# EasyEDA Pro project BMS-Mainboard.epro, schematic Schematic1

## Sheets
1 BQ7693: Assembly Variant: Basic; Board Name: Board1; Create Date: 2026-09-22; Page Name: P1; Project Name: BMS 主控板; Schematic Name: Schematic1; Update Date: 2026-09-22; Company: 嘉立创EDA; Page Size: A4; Version: V1.0
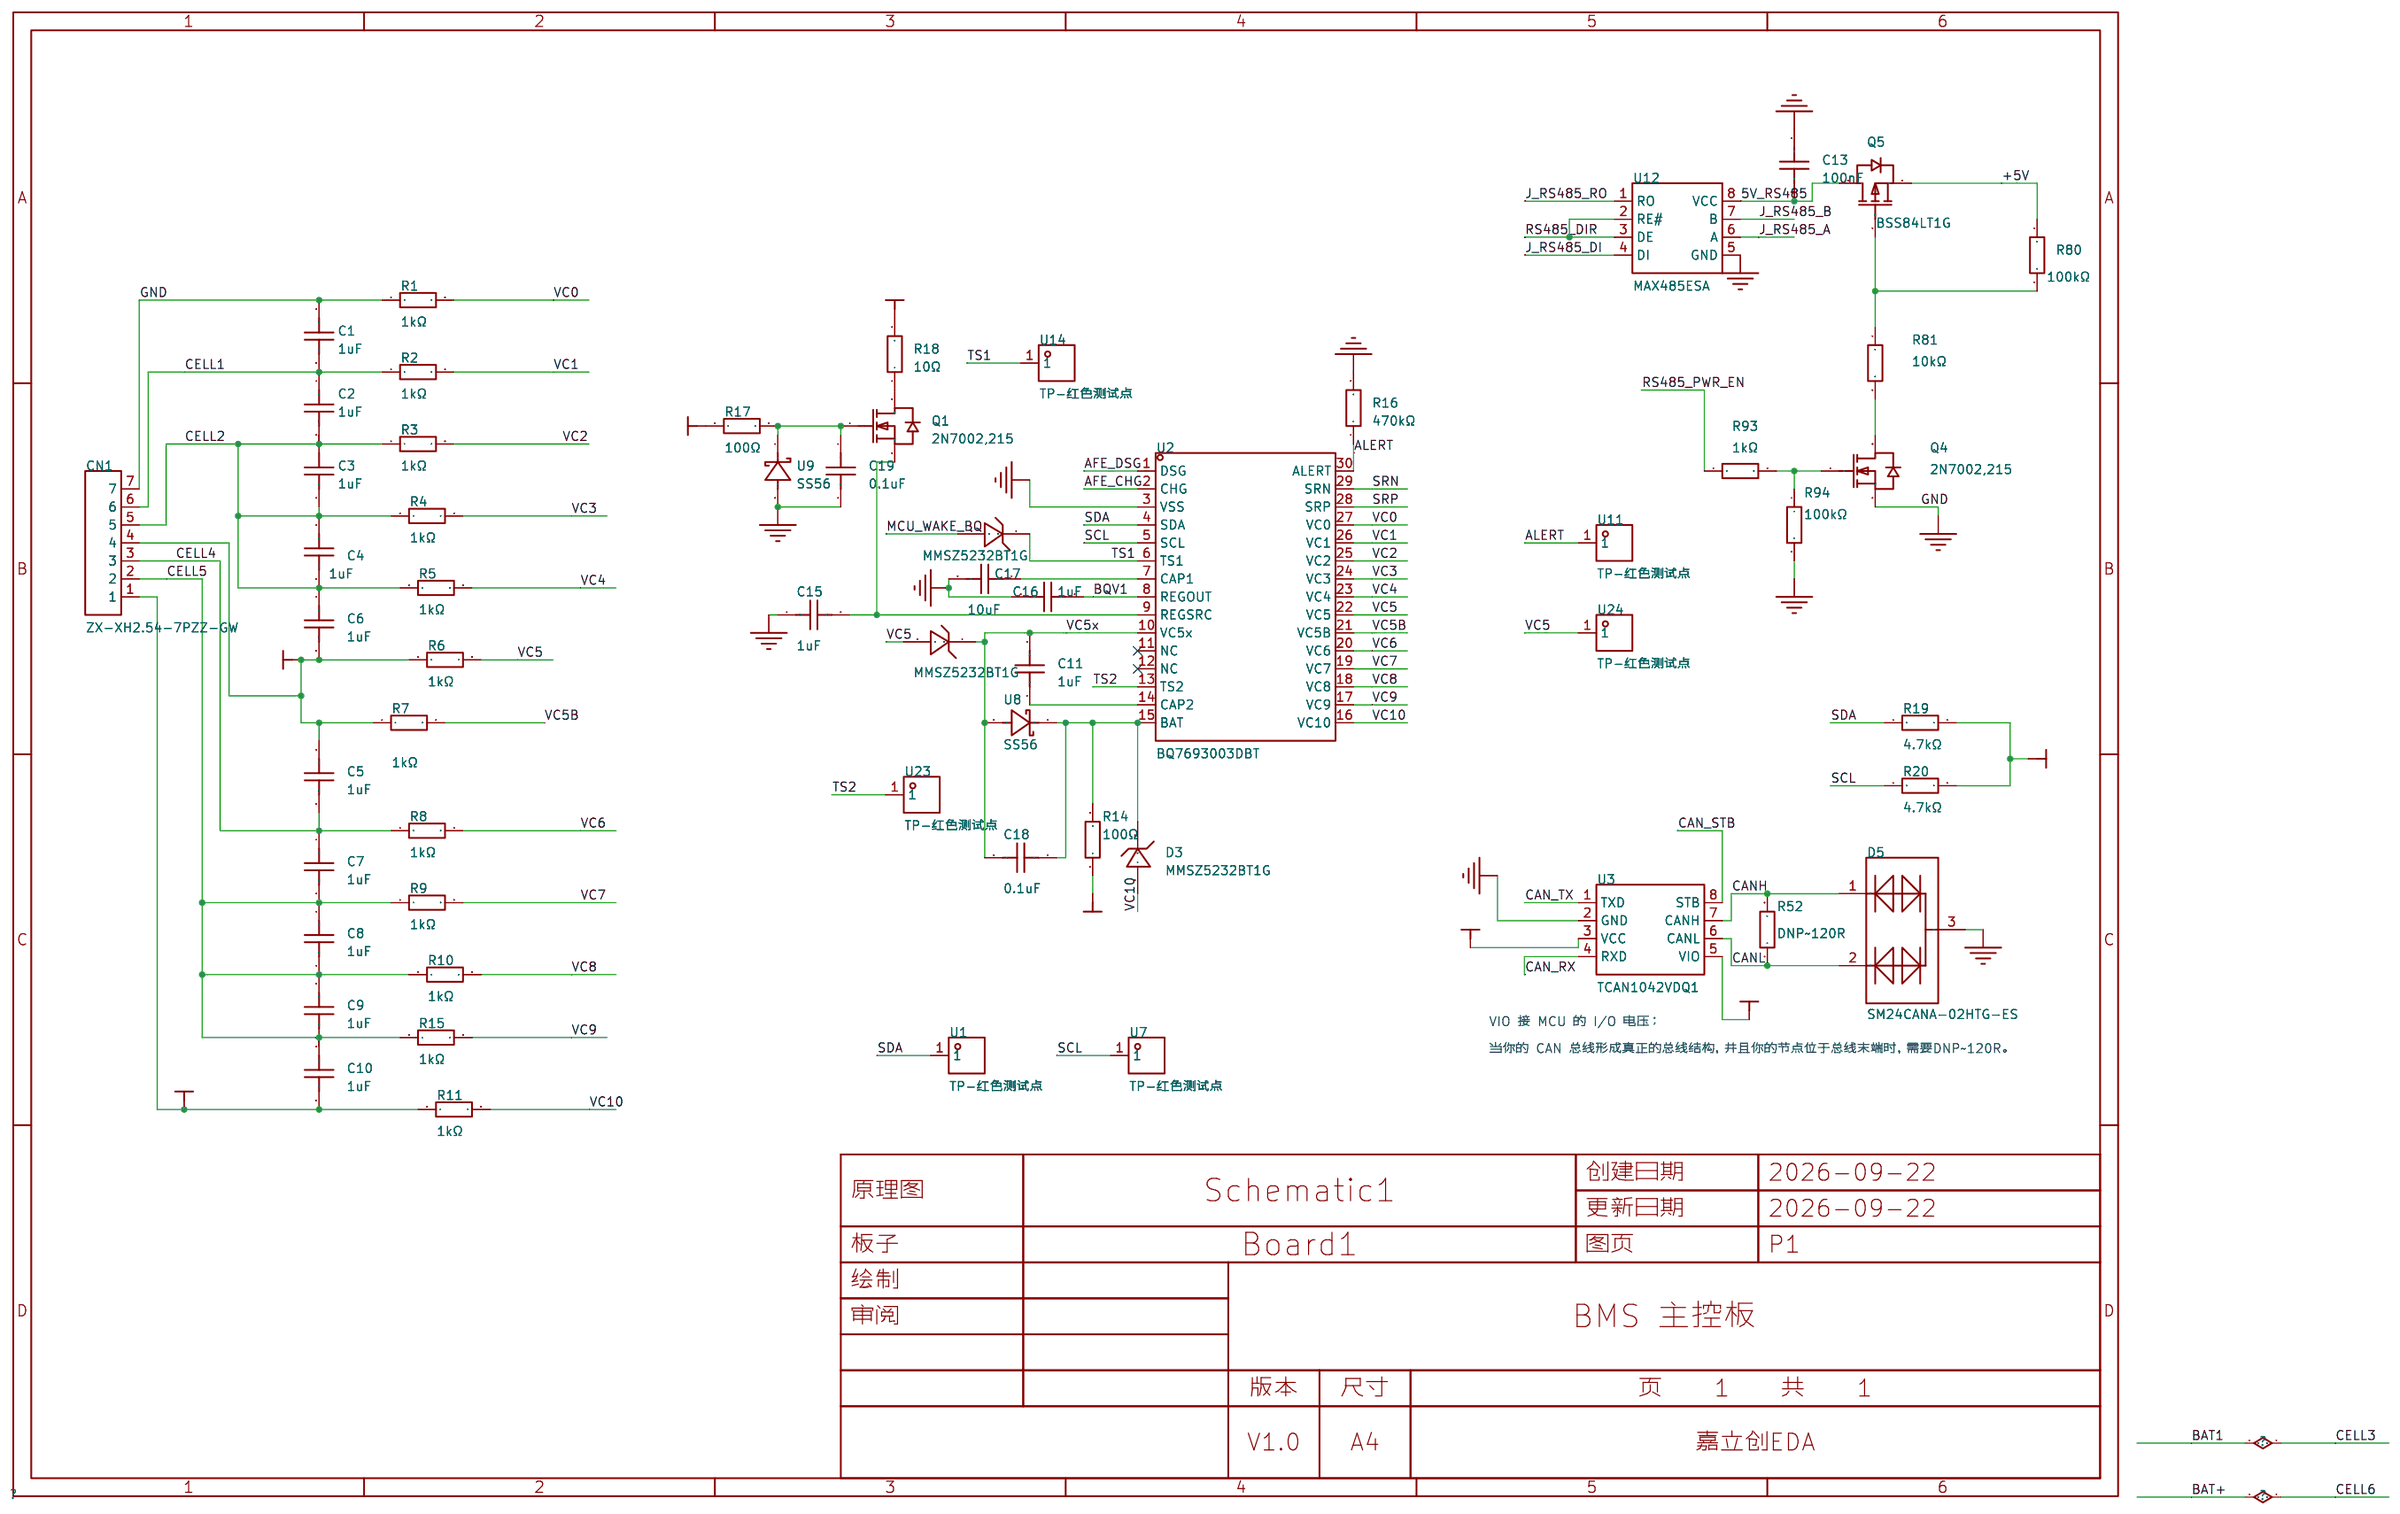
[diagram p1: BQ7693]
2 power: Create Date: 2026-09-27; Page Name: P2; Update Date: 2026-09-27
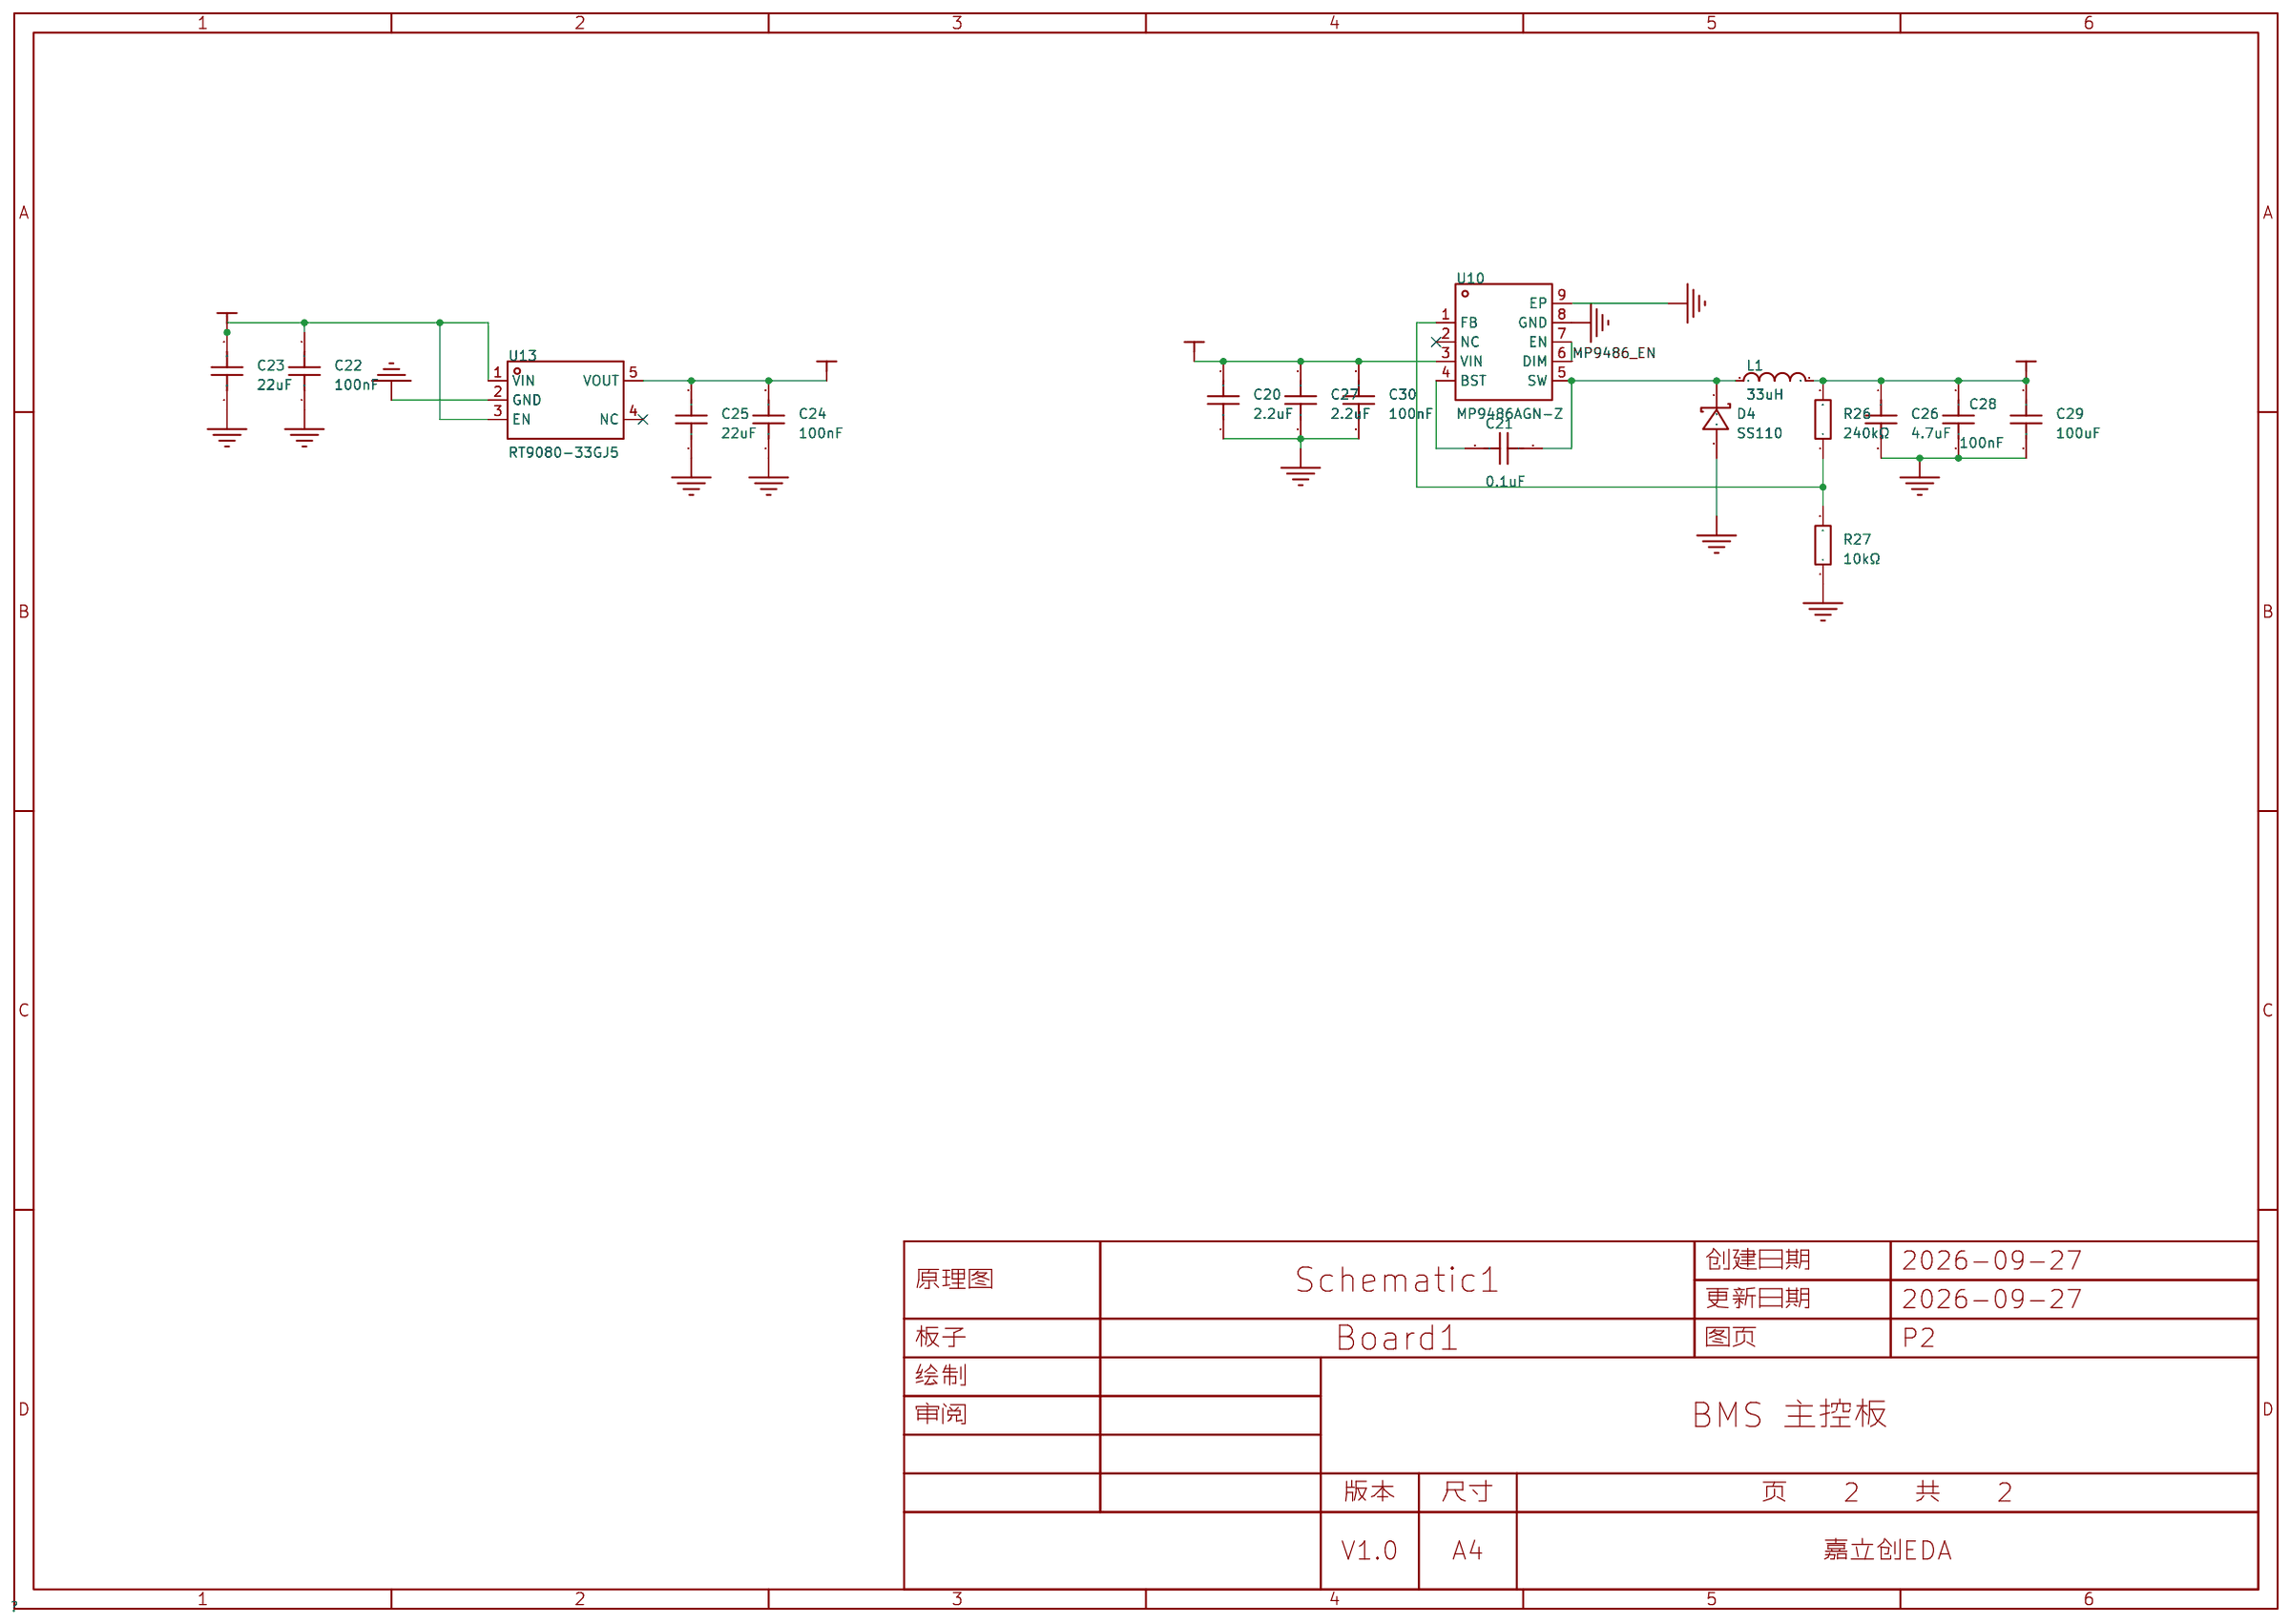
[diagram p2: power]
3 input_detect: Create Date: 2026-10-07; Page Name: P2; Update Date: 2026-10-07
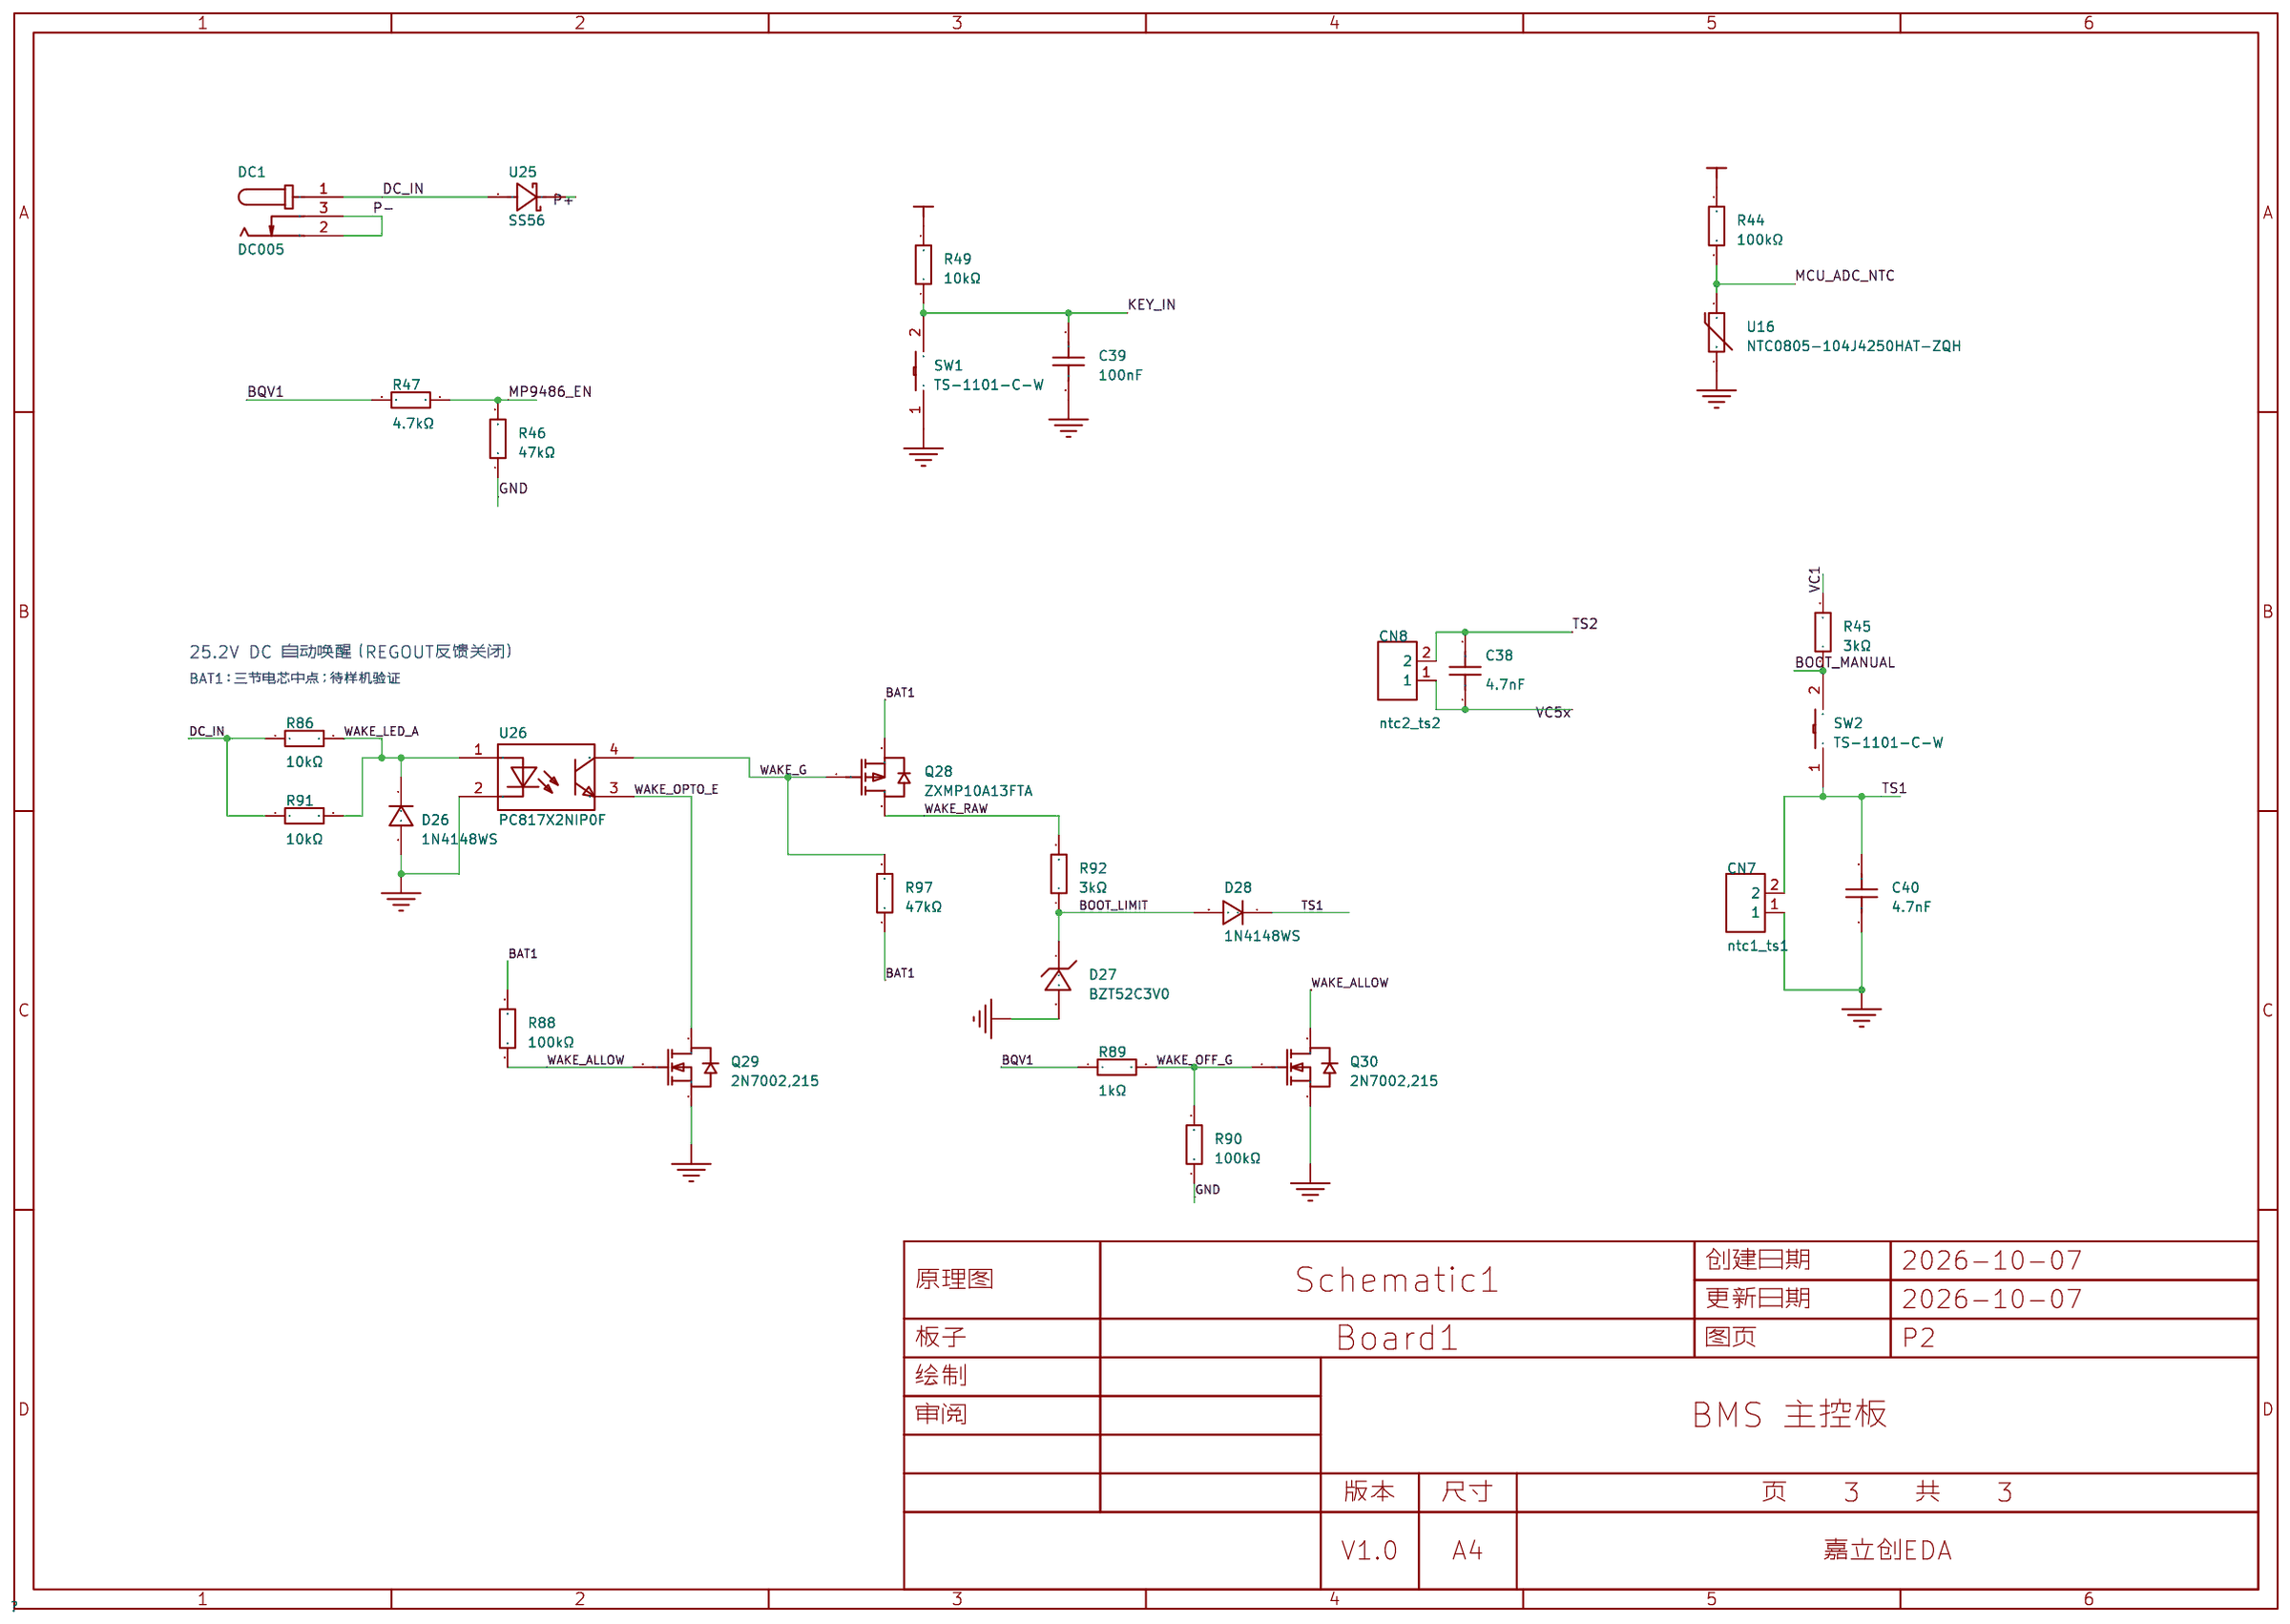
[diagram p3: input_detect]
4 output_detect: Create Date: 2026-10-07; Page Name: P2; Update Date: 2026-10-07
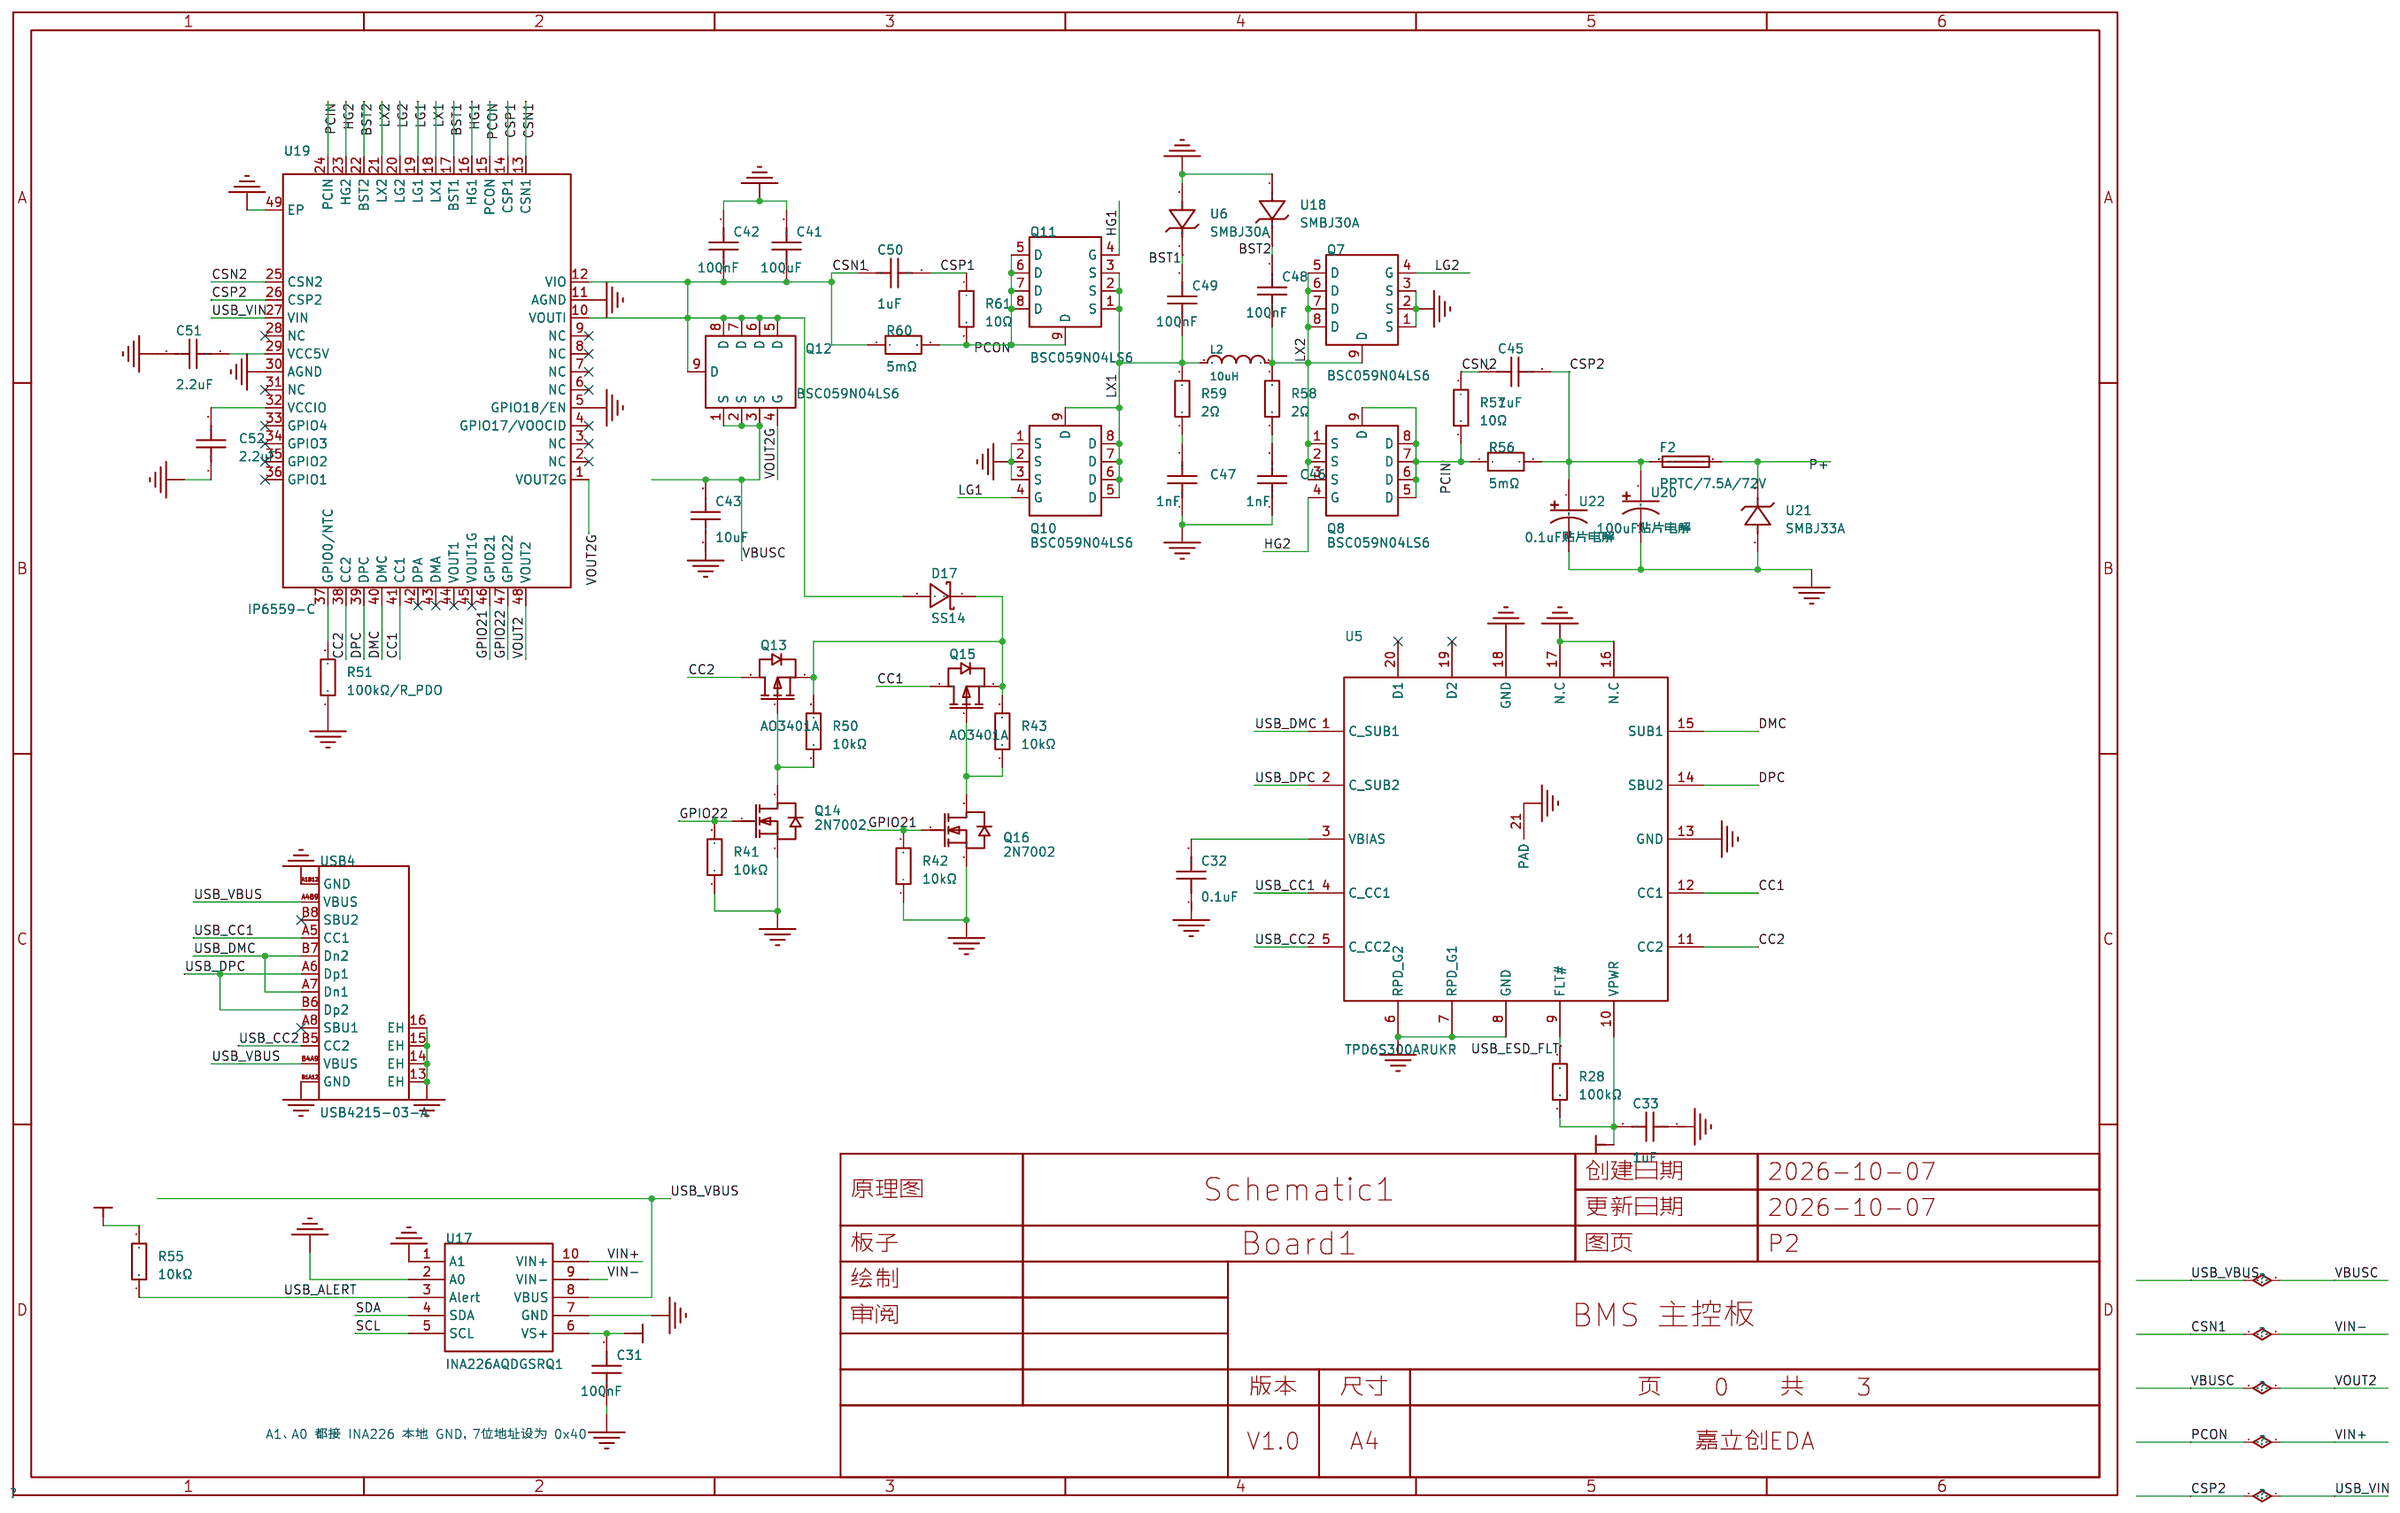
[diagram p4: output_detect]
5 esp32c3: Create Date: 2026-10-19; Update Date: 2026-10-19
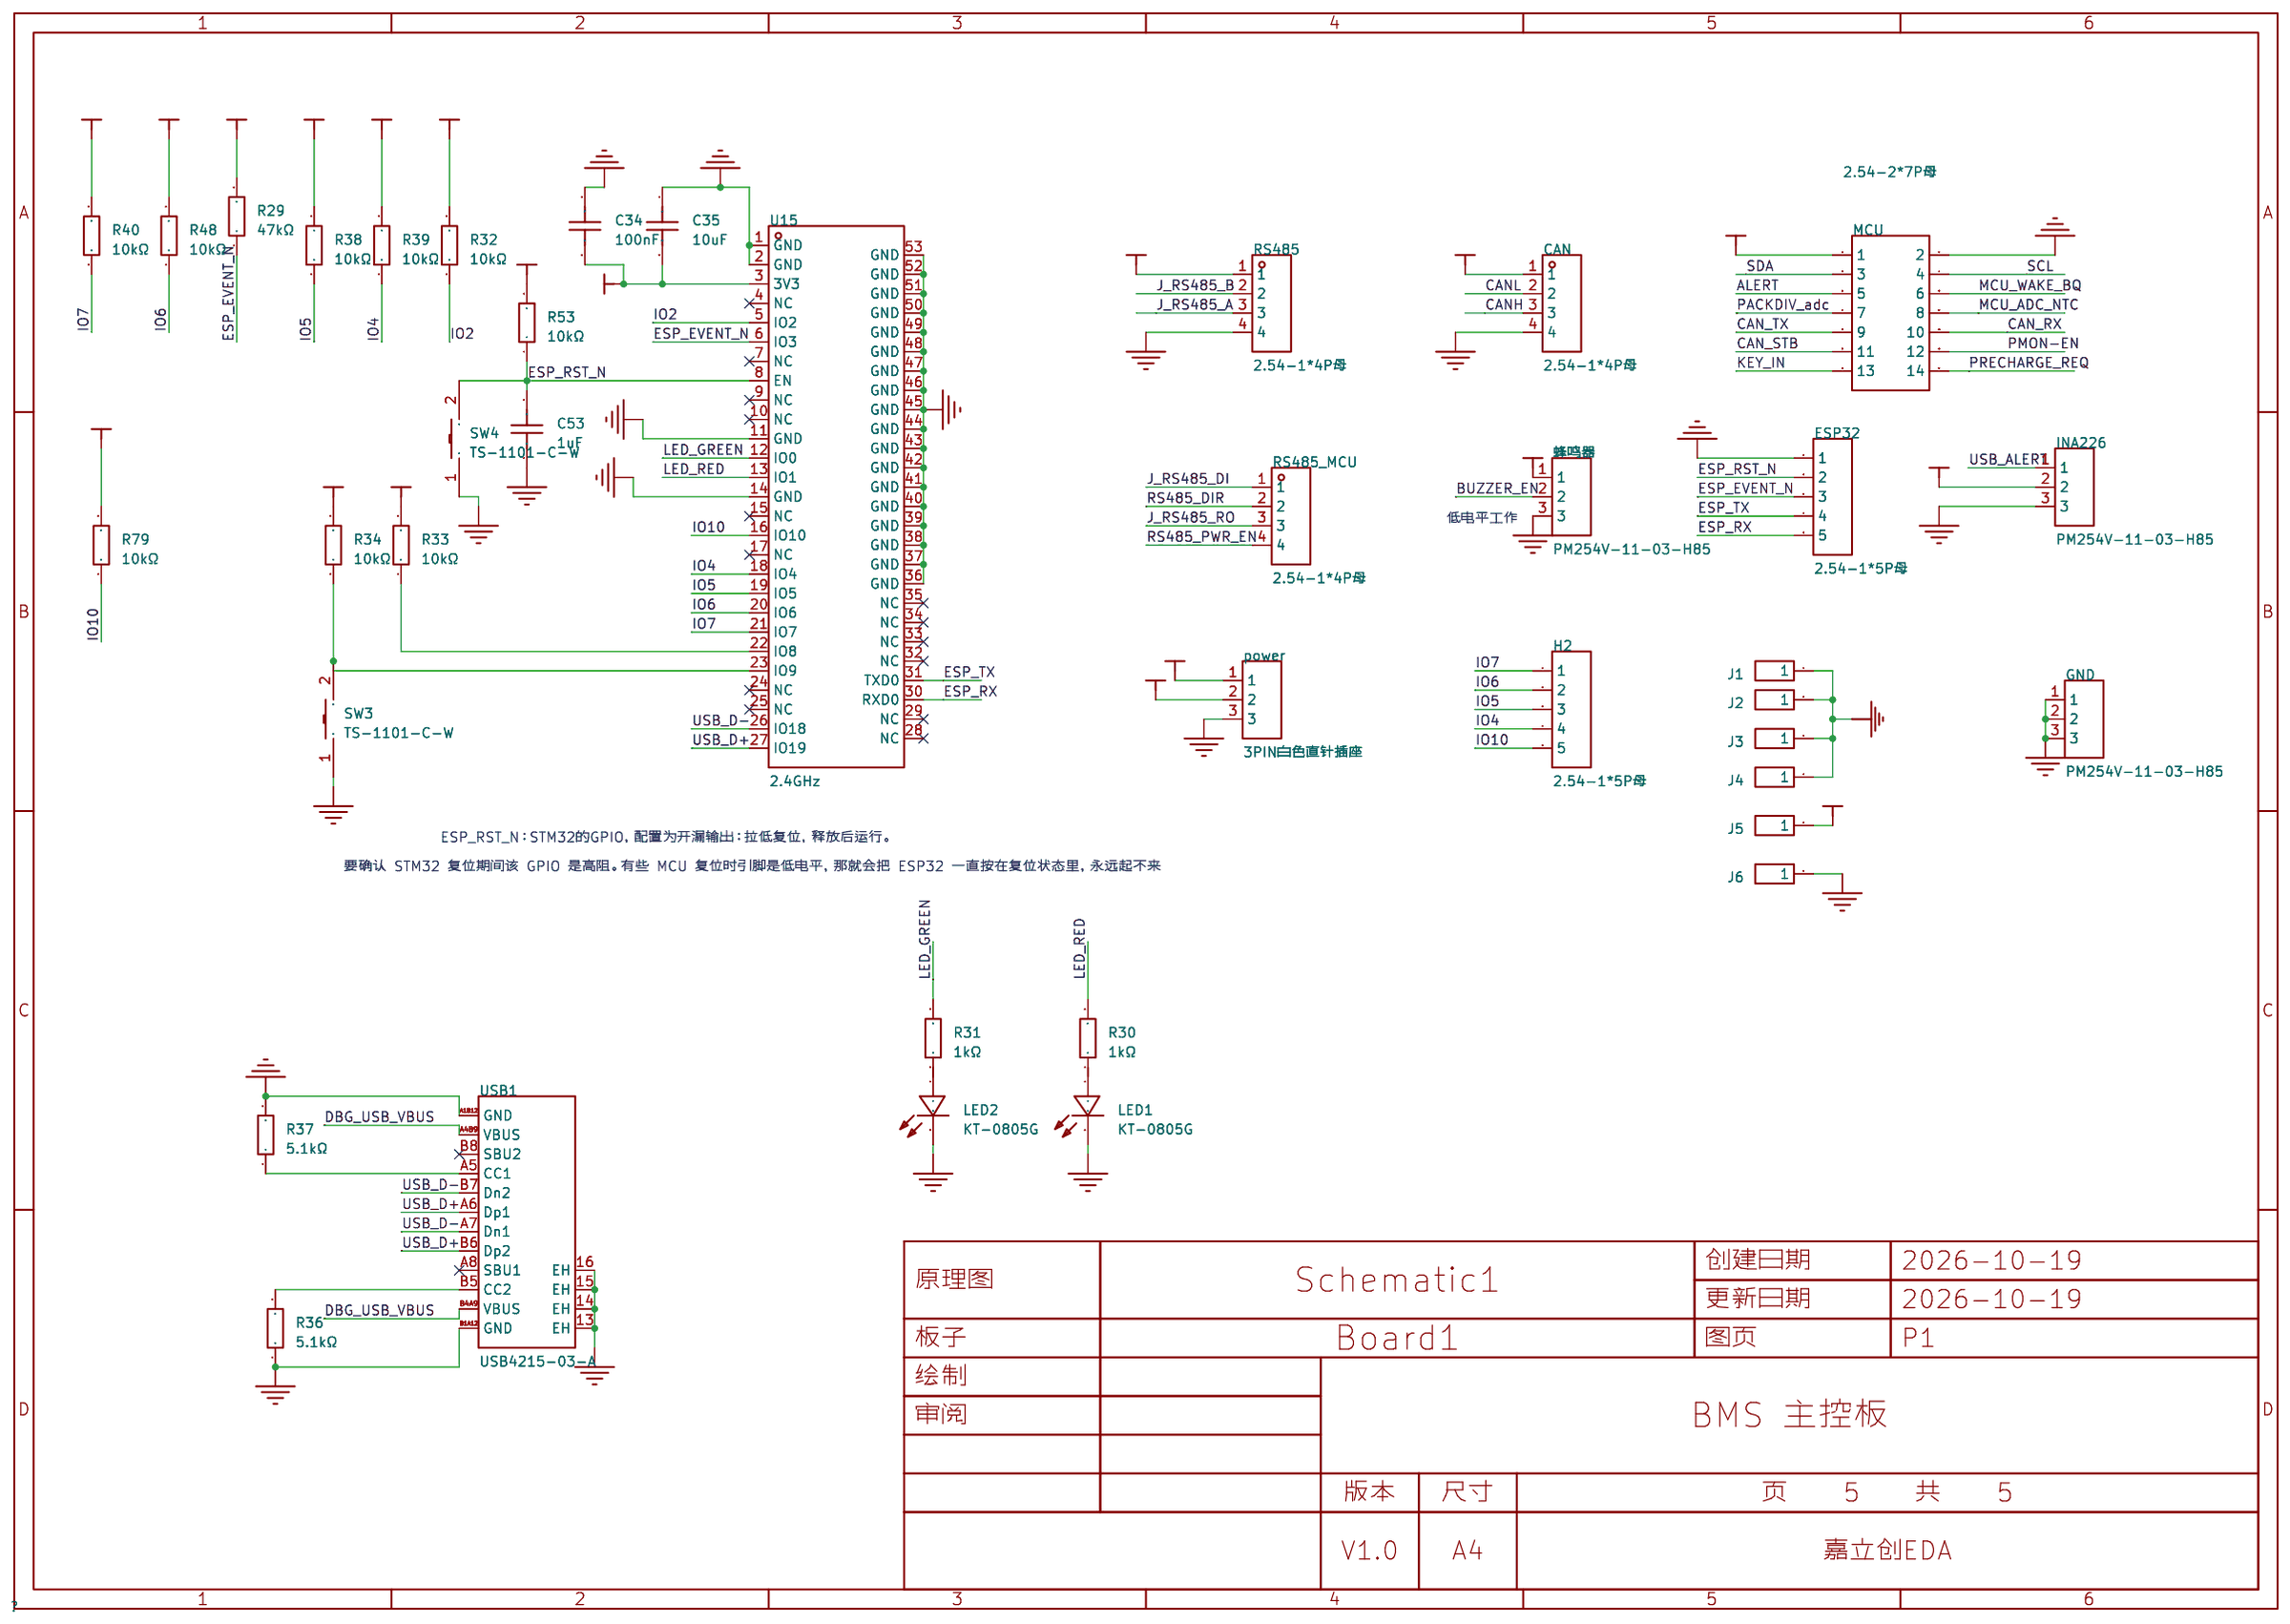
[diagram p5: esp32c3]
6 battery protection: Create Date: 2026-10-21; Update Date: 2026-10-21
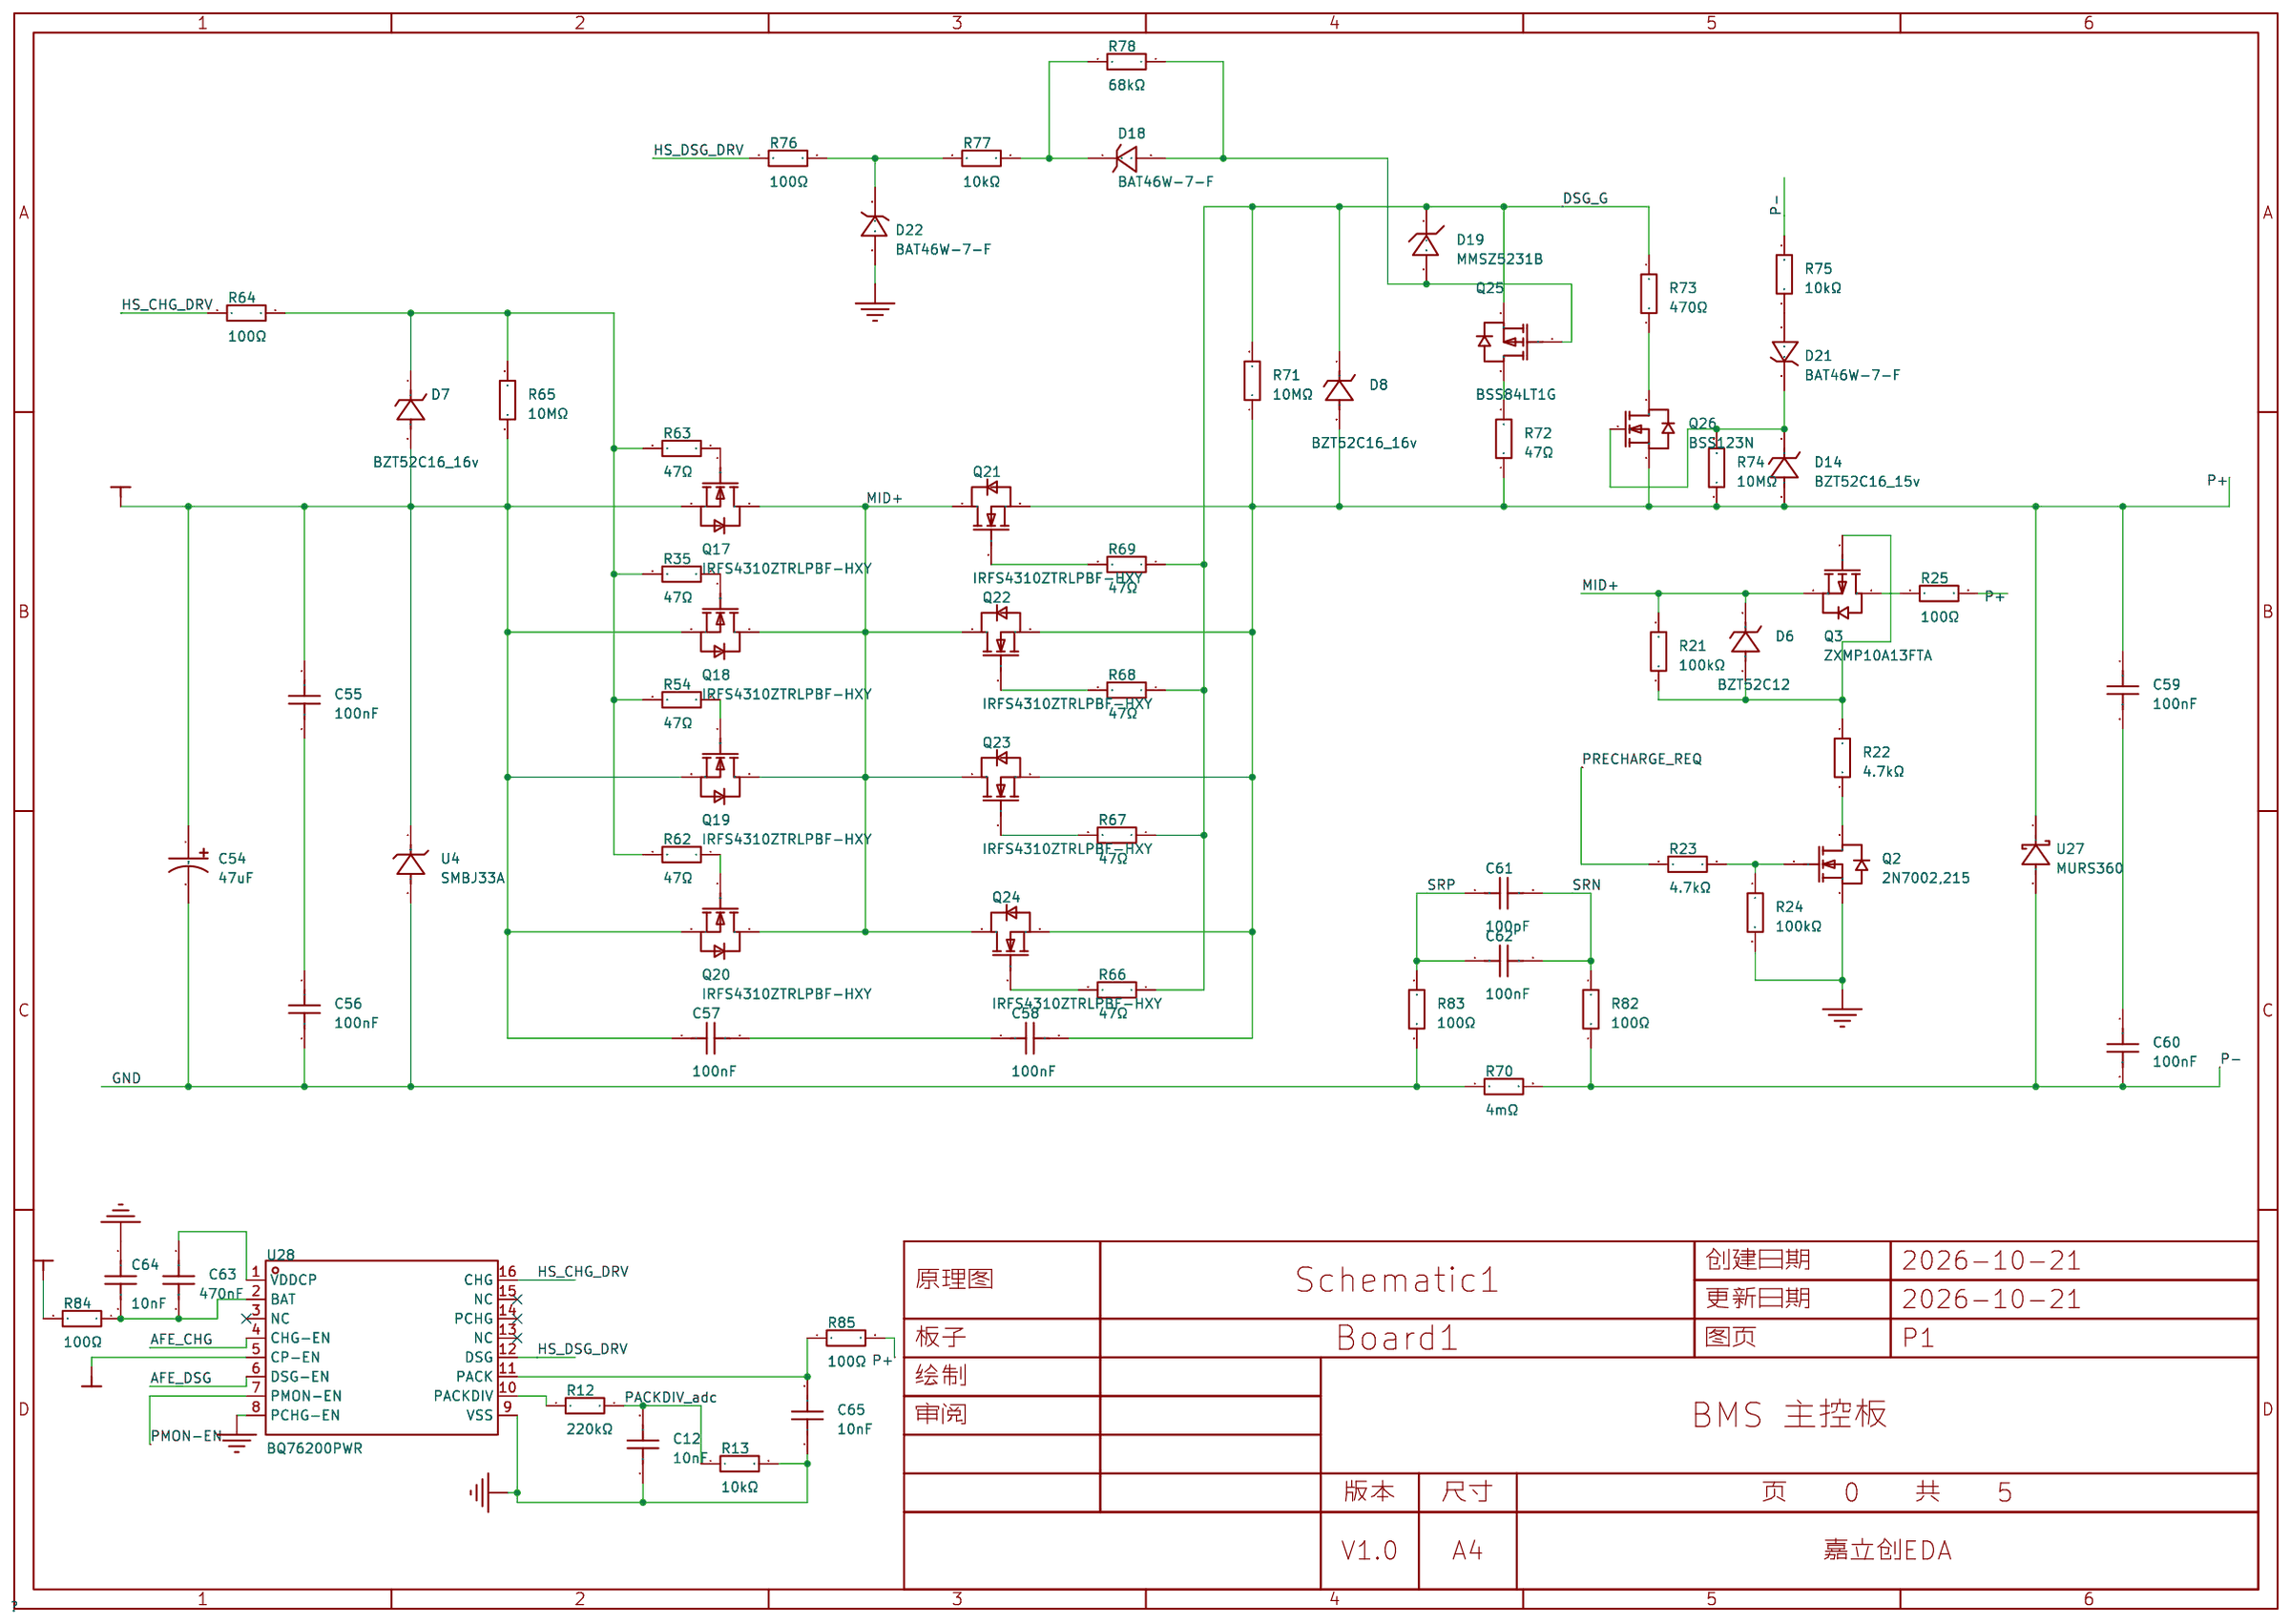
[diagram p6: battery protection]

## Parts
sheet battery protection
C12  10nF  [C0603]
C54  47uF  [CAP-TH_BD6.3-P2.50-D0.6-FD]
C55  100nF  [C0603]
C56  100nF  [C0603]
C57  100nF  [C0603]
C58  100nF  [C0603]
C59  100nF  [C0603]
C60  100nF  [C0603]
C61  100pF  [C0603]
C62  100nF  [C0603]
C63  470nF  [C0603]
C64  10nF  [C0603]
C65  10nF  [C0603]
D6  BZT52C12  [SOD-123_L2.7-W1.6-LS3.7-RD]
D7  BZT52C16_16v  [SOD-123_L2.7-W1.6-LS3.7-RD]
D8  BZT52C16_16v  [SOD-123_L2.7-W1.6-LS3.7-RD]
D14  BZT52C16_15v  [SOD-123_L2.7-W1.6-LS3.7-RD]
D18  BAT46W-7-F  [SOD-123_L2.8-W1.8-LS3.7-RD]
D19  MMSZ5231B  [SOD-123_L2.8-W1.8-LS3.7-RD]
D21  BAT46W-7-F  [SOD-123_L2.8-W1.8-LS3.7-RD]
D22  BAT46W-7-F  [SOD-123_L2.8-W1.8-LS3.7-RD]
Q2  2N7002,215  [SOT-23_L2.9-W1.3-P1.90-LS2.4-BR]
Q3  ZXMP10A13FTA  [SOT-23-3_L2.9-W1.6-P1.90-LS2.8-BR]
Q17  IRFS4310ZTRLPBF-HXY  [TO-263-2_L10.0-W8.8-P5.08-LS15.4-BR]
Q18  IRFS4310ZTRLPBF-HXY  [TO-263-2_L10.0-W8.8-P5.08-LS15.4-BR]
Q19  IRFS4310ZTRLPBF-HXY  [TO-263-2_L10.0-W8.8-P5.08-LS15.4-BR]
Q20  IRFS4310ZTRLPBF-HXY  [TO-263-2_L10.0-W8.8-P5.08-LS15.4-BR]
Q21  IRFS4310ZTRLPBF-HXY  [TO-263-2_L10.0-W8.8-P5.08-LS15.4-BR]
Q22  IRFS4310ZTRLPBF-HXY  [TO-263-2_L10.0-W8.8-P5.08-LS15.4-BR]
Q23  IRFS4310ZTRLPBF-HXY  [TO-263-2_L10.0-W8.8-P5.08-LS15.4-BR]
Q24  IRFS4310ZTRLPBF-HXY  [TO-263-2_L10.0-W8.8-P5.08-LS15.4-BR]
Q25  BSS84LT1G  [SOT-23-3_L2.9-W1.6-P1.90-LS2.8-BR]
Q26  BSS123N  [SOT-23-3_L2.9-W1.3-P1.90-LS2.4-BR]
R12  220kΩ  [R0603]
R13  10kΩ  [R0603]
R21  100kΩ  [R0603]
R22  4.7kΩ  [R0603]
R23  4.7kΩ  [R0603]
R24  100kΩ  [R0603]
R25  100Ω  [R0603]
R35  47Ω  [R0603]
R54  47Ω  [R0603]
R62  47Ω  [R0603]
R63  47Ω  [R0603]
R64  100Ω  [R0603]
R65  10MΩ  [R0603]
R66  47Ω  [R0603]
R67  47Ω  [R0603]
R68  47Ω  [R0603]
R69  47Ω  [R0603]
R70  4mΩ  [R2512]
R71  10MΩ  [R0603]
R72  47Ω  [R0603]
R73  470Ω  [R0603]
R74  10MΩ  [R0603]
R75  10kΩ  [R0603]
R76  100Ω  [R0603]
R77  10kΩ  [R0603]
R78  68kΩ  [R0603]
R82  100Ω  [R0603]
R83  100Ω  [R0603]
R84  100Ω  [R0603]
R85  100Ω  [R0603]
U4  SMBJ33A  [SMB_L4.4-W3.6-LS5.4-RD]
U27  MURS360  [SMB_L4.3-W3.6-LS5.4-RD]
U28  BQ76200PWR  [TSSOP-16_L5.0-W4.4-P0.65-LS6.4-BL]
sheet BQ7693
C1  1uF  [C0603]
C2  1uF  [C0603]
C3  1uF  [C0603]
C4  1uF  [C0603]
C5  1uF  [C0603]
C6  1uF  [C0603]
C7  1uF  [C0603]
C8  1uF  [C0603]
C9  1uF  [C0603]
C10  1uF  [C0603]
C11  1uF  [C0603]
C13  100nF  [C0603]
C15  1uF  [C0603]
C16  1uF  [C0603]
C17  10uF  [C0603]
C18  0.1uF  [C0603]
C19  0.1uF  [C0603]
CN1  ZX-XH2.54-7PZZ-GW  [CONN-TH_7P-P2.50_HCTL_XH-7A]
D1  MMSZ5232BT1G  [SOD-123_L2.7-W1.6-LS3.7-RD]
D2  MMSZ5232BT1G  [SOD-123_L2.7-W1.6-LS3.7-RD]
D3  MMSZ5232BT1G  [SOD-123_L2.7-W1.6-LS3.7-RD]
D5  SM24CANA-02HTG-ES  [SOT-23-3_L2.9-W1.3-P1.90-LS2.4-BR]
Q1  2N7002,215  [SOT-23_L2.9-W1.3-P1.90-LS2.4-BR]
Q4  2N7002,215  [SOT-23_L2.9-W1.3-P1.90-LS2.4-BR]
Q5  BSS84LT1G  [SOT-23-3_L2.9-W1.6-P1.90-LS2.8-BR]
R1  1kΩ  [R0603]
R2  1kΩ  [R0603]
R3  1kΩ  [R0603]
R4  1kΩ  [R0603]
R5  1kΩ  [R0603]
R6  1kΩ  [R0603]
R7  1kΩ  [R0603]
R8  1kΩ  [R0603]
R9  1kΩ  [R0603]
R10  1kΩ  [R0603]
R11  1kΩ  [R0603]
R14  100Ω  [R0603]
R15  1kΩ  [R0603]
R16  470kΩ  [R0603]
R17  100Ω  [R0603]
R18  10Ω  [R0603]
R19  4.7kΩ  [R0603]
R20  4.7kΩ  [R0603]
R52  DNP~120R  [R0603]
R80  100kΩ  [R0603]
R81  10kΩ  [R0603]
R93  1kΩ  [R0603]
R94  100kΩ  [R0603]
U1  TP-红色测试点  [TESTPOINT-TH_BD3.2]
U2  BQ7693003DBT  [TSSOP-30_L7.8-W4.4-P0.50-LS6.4-BL]
U3  TCAN1042VDQ1  [SOIC-8_L4.9-W3.9-P1.27-LS6.0-BL]
U7  TP-红色测试点  [TESTPOINT-TH_BD3.2]
U8  SS56  [SMB_L4.3-W3.6-LS5.4-RD]
U9  SS56  [SMB_L4.3-W3.6-LS5.4-RD]
U11  TP-红色测试点  [TESTPOINT-TH_BD3.2]
U12  MAX485ESA  [SOP-8_L4.9-W3.9-P1.27-LS6.0-BL]
U14  TP-红色测试点  [TESTPOINT-TH_BD3.2]
U23  TP-红色测试点  [TESTPOINT-TH_BD3.2]
U24  TP-红色测试点  [TESTPOINT-TH_BD3.2]
sheet esp32c3
C34  100nF  [C0603]
C35  10uF  [C0603]
C53  1uF  [C0603]
CAN  2.54-1*4P母  [HDR-TH_4P-P2.54-V-F]
ESP32  2.54-1*5P母  [HDR-TH_5P-P2.54-V-F]
GND  PM254V-11-03-H85  [HDR-TH_3P-P2.54-V-F]
H2  2.54-1*5P母  [HDR-TH_5P-P2.54-V-F]
INA226  PM254V-11-03-H85  [HDR-TH_3P-P2.54-V-F]
J1  HDR-M-2.54_1x1  [定位孔]
J2  HDR-M-2.54_1x1  [定位孔]
J3  HDR-M-2.54_1x1  [定位孔]
J4  HDR-M-2.54_1x1  [定位孔]
J5  HDR-M-2.54_1x1  [定位孔]
J6  HDR-M-2.54_1x1  [定位孔]
LED1  KT-0805G  [LED0805-R-RD]
LED2  KT-0805G  [LED0805-R-RD]
MCU  2.54-2*7P母  [HDR-TH_14P-P2.54-V-F-R2-C7-S2.54-1]
power  3PIN白色直针插座  [CONN-TH_3P-P2.50_3PIN]
R29  47kΩ  [R0603]
R30  1kΩ  [R0603]
R31  1kΩ  [R0603]
R32  10kΩ  [R0603]
R33  10kΩ  [R0603]
R34  10kΩ  [R0603]
R36  5.1kΩ  [R0603]
R37  5.1kΩ  [R0603]
R38  10kΩ  [R0603]
R39  10kΩ  [R0603]
R40  10kΩ  [R0603]
R48  10kΩ  [R0603]
R53  10kΩ  [R0603]
R79  10kΩ  [R0603]
RS485  2.54-1*4P母  [HDR-TH_4P-P2.54-V-F]
RS485_MCU  2.54-1*4P母  [HDR-TH_4P-P2.54-V-F]
SW3  TS-1101-C-W  [SW-SMD_L6.0-W3.3-LS8.0_TS-1101-C-W]
SW4  TS-1101-C-W  [SW-SMD_L6.0-W3.3-LS8.0_TS-1101-C-W]
U15  2.4GHz  [WIFIM-SMD_ESP32-C3-MINI-1]
USB1  USB4215-03-A  [USB-C-SMD_GT-USB-7010B]
蜂鸣器  PM254V-11-03-H85  [HDR-TH_3P-P2.54-V-F]
sheet input_detect
C38  4.7nF  [C0603]
C39  100nF  [C0603]
C40  4.7nF  [C0603]
CN7  ntc1_ts1  [CONN-TH_XH2.54-2P]
CN8  ntc2_ts2  [CONN-TH_XH2.54-2P]
D26  1N4148WS  [SOD-323_L1.8-W1.3-LS2.5-RD]
D27  BZT52C3V0  [SOD-123_L2.8-W1.8-LS3.7-RD]
D28  1N4148WS  [SOD-323_L1.8-W1.3-LS2.5-RD]
DC1  DC005  [DC-IN-TH_DC005]
Q28  ZXMP10A13FTA  [SOT-23-3_L2.9-W1.6-P1.90-LS2.8-BR]
Q29  2N7002,215  [SOT-23_L2.9-W1.3-P1.90-LS2.4-BR]
Q30  2N7002,215  [SOT-23_L2.9-W1.3-P1.90-LS2.4-BR]
R44  100kΩ  [R0603]
R45  3kΩ  [R0603]
R46  47kΩ  [R0603]
R47  4.7kΩ  [R0603]
R49  10kΩ  [R0603]
R86  10kΩ  [R0603]
R88  100kΩ  [R0603]
R89  1kΩ  [R0603]
R90  100kΩ  [R0603]
R91  10kΩ  [R0603]
R92  3kΩ  [R0603]
R97  47kΩ  [R0603]
SW1  TS-1101-C-W  [SW-SMD_L6.0-W3.3-LS8.0_TS-1101-C-W]
SW2  TS-1101-C-W  [SW-SMD_L6.0-W3.3-LS8.0_TS-1101-C-W]
U16  NTC0805-104J4250HAT-ZQH  [R0603]
U25  SS56  [SMB_L4.3-W3.6-LS5.4-RD]
U26  PC817X2NIP0F  [SMD-4_L4.6-W6.5-P2.54-LS10.2-TL]
sheet output_detect
C31  100nF  [C0603]
C32  0.1uF  [C0603]
C33  1uF  [C0603]
C41  100uF  [C0603]
C42  100nF  [C0603]
C43  10uF  [C0603]
C45  1uF  [C0603]
C46  1nF  [C0603]
C47  1nF  [C0603]
C48  100nF  [C0603]
C49  100nF  [C0603]
C50  1uF  [C0603]
C51  2.2uF  [C0603]
C52  2.2uF  [C0603]
D17  SS14  [SMA_L4.2-W2.6-LS5.0-RD_1]
F2  PPTC/7.5A/72V  [FUSE-TH_L10.8-W2.7-P4.85-D0.6-S0.1]
L2  10uH  [IND-SMD_L17.5-W17.5_CKST1707]
Q7  BSC059N04LS6  [TDSON-8_L6.0-W5.0-P1.27-LS6.2-BL]
Q8  BSC059N04LS6  [TDSON-8_L6.0-W5.0-P1.27-LS6.2-BL]
Q10  BSC059N04LS6  [TDSON-8_L6.0-W5.0-P1.27-LS6.2-BL]
Q11  BSC059N04LS6  [TDSON-8_L6.0-W5.0-P1.27-LS6.2-BL]
Q12  BSC059N04LS6  [TDSON-8_L6.0-W5.0-P1.27-LS6.2-BL]
Q13  AO3401A  [SOT-23-3_L2.9-W1.3-P1.90-LS2.4-BR]
Q14  2N7002  [SOT-23-3_L2.9-W1.3-P1.90-LS2.4-BR]
Q15  AO3401A  [SOT-23-3_L2.9-W1.3-P1.90-LS2.4-BR]
Q16  2N7002  [SOT-23-3_L2.9-W1.3-P1.90-LS2.4-BR]
R28  100kΩ  [R0603]
R41  10kΩ  [R0603]
R42  10kΩ  [R0603]
R43  10kΩ  [R0603]
R50  10kΩ  [R0603]
R51  100kΩ/R_PDO  [R0603]
R55  10kΩ  [R0603]
R56  5mΩ  [R2512]
R57  10Ω  [R0603]
R58  2Ω  [R0603]
R59  2Ω  [R0603]
R60  5mΩ  [R2512]
R61  10Ω  [R0603]
U5  TPD6S300ARUKR  [WQFN-20_L3.0-W3.0-P0.40-TL-EP1.7]
U6  SMBJ30A  [SMB_L4.4-W3.6-LS5.4-RD]
U17  INA226AQDGSRQ1  [VSSOP-10_L3.0-W3.0-P0.50-LS4.9-BL]
U18  SMBJ30A  [SMB_L4.4-W3.6-LS5.4-RD]
U19  IP6559-C  [QFN-48_L7.0-W7.0-P0.50-BL-EP5.4]
U20  100uF贴片电解  [CAP-SMD_BD6.3-L6.6-W6.6-LS7.4-FD]
U21  SMBJ33A  [SMB_L4.4-W3.6-LS5.4-RD]
U22  0.1uF贴片电解  [CAP-SMD_BD6.3-L6.6-W6.6-LS7.4-FD]
USB4  USB4215-03-A  [USB-C-SMD_GT-USB-7010B]
sheet power
C20  2.2uF  [C0603]
C21  0.1uF  [C0603]
C22  100nF  [C0603]
C23  22uF  [C0603]
C24  100nF  [C0603]
C25  22uF  [C0603]
C26  4.7uF  [C0603]
C27  2.2uF  [C0603]
C28  100nF  [C0603]
C29  100uF  [C0603]
C30  100nF  [C0603]
D4  SS110  [PMDS_L4.5-W2.6-LS5.0-RD]
L1  33uH  [IND-SMD_L7.7-W6.6_APS07A30M220]
R26  240kΩ  [R0603]
R27  10kΩ  [R0603]
U10  MP9486AGN-Z  [SOIC-8_L4.9-W3.9-P1.27-LS6.0-BL-EP3.1]
U13  RT9080-33GJ5  [TSOT-23-5_L2.9-W1.6-P0.95-LS2.8-BL]

## Library data of the parts
C1-C13 C15-C21 C26-C30 C55-C65 = FN21F104Z500PAG: 容值:100nF;精度:-20%~+80%;额定电压:50V;温度系数:Y5V;; LCSC Part Name: 停产 100nF -20%~+80% 50V; Supplier Part: C525279; Manufacturer: PSA(信昌电陶); Supplier Footprint: 0805; JLCPCB Part Class: Extended Part; Datasheet: https://item.szlcsc.com/datasheet/FN21F104Z500PAG/543406.html; Supplier: LCSC; Tolerance: -20%~+80%; Voltage Rating: 50V; Temperature Coefficient: Y5V
C54 = 50YXM47MEFR6.3X11_C2892900: 容值:47uF;精度:±20%;额定电压:50V;纹波电流:-;等效串联电阻(ESR):-;; LCSC Part Name: 47uF ±20% 50V; Supplier Part: C2892900; Manufacturer: Rubycon(红宝石); Manufacturer Part: 50YXM47MEFR6.3X11; Supplier Footprint: 插件,D6.3xL11mm; JLCPCB Part Class: Extended Part; Datasheet: https://item.szlcsc.com/datasheet/50YXM47MEFR6.3X11/3129132.html; Supplier: LCSC; Tolerance: ±20%; Voltage Rating: 50V; Diameter: 6.3mm; Height - Seated (Max): 11mm; Operating Temperature: -40℃~+105℃
D6-D8 D14 = BZT52C16: 二极管配置:1个独立式;稳压值(标称值):16V;稳压值(范围值):15.3V~17.1V;耗散功率(Pd):500mW;; LCSC Part Name: 独立式 耐压:16V 电流:0.1uA; Supplier Part: C707145; Manufacturer: Slkor(萨科微); Supplier Footprint: SOD-123; JLCPCB Part Class: Extended Part; Datasheet: https://item.szlcsc.com/datasheet/BZT52C16/744267.html; Supplier: LCSC; Diode Configuration: 1个独立式; Zener Voltage(Nom): 16V; Reverse Leakage Current (Ir): 100nA; Zener Voltage(Range): 15.3V~17.1V; Pd - Power Dissipation: 500mW; Impedance(Zzt): 40Ω; Impedance(Zzk): 200Ω; Operating Junction Temperature Range: -65℃~+150℃
D18 D21 D22 = BAT46W-7-F: 二极管配置:1个独立式;正向压降(Vf):450mV@10mA;直流反向耐压(Vr):100V;整流电流:150mA;; LCSC Part Name: 电压:100V 电流:150mA; Supplier Part: C83152; Manufacturer: DIODES(美台); Supplier Footprint: SOD-123; JLCPCB Part Class: Extended Part; Datasheet: https://item.szlcsc.com/datasheet/BAT46W-7-F/84316.html; Supplier: LCSC; Diode Configuration: 1个独立式; Voltage - Forward(Vf@If): 450mV@10mA; Voltage - DC Reverse(Vr): 100V; Current - Rectified: 150mA; Reverse Leakage Current (Ir): 2uA@75V; Operating Junction Temperature Range: -55℃~+125℃; Non-Repetitive Peak Forward Surge Current: 750mA; Power Dissipation: 200mW
D19 = MMSZ5231B: 二极管配置:1个独立式;稳压值(标称值):5.1V;稳压值(范围):4.85V~5.36V;耗散功率(Pd):500mW;; LCSC Part Name: 丝印E1 独立式 耐压:5.1V 电流:5uA@2.0V; Supplier Part: C21563; Manufacturer: CJ(江苏长电/长晶); Supplier Footprint: SOD-123; JLCPCB Part Class: Extended Part; Datasheet: https://item.szlcsc.com/datasheet/MMSZ5231B/22284.html; Supplier: LCSC; Diode Configuration: 1个独立式; Zener Voltage(Nom): 5.1V; Reverse Leakage Current (Ir): 5uA@2V; Zener Voltage(Range): 4.85V~5.36V; Pd - Power Dissipation: 500mW; Impedance(Zzt): 17Ω; Impedance(Zzk): 1.6kΩ; Operating Junction Temperature Range: -55℃~+150℃
Q1 Q2 Q4 Q29 Q30 = 2N7002,215: 数量:1个N沟道;漏源电压(Vdss):60V;连续漏极电流(Id):300mA;导通电阻(RDS(on)):5Ω@10V;耗散功率(Pd):830mW;阈值电压(Vgs(th)):2.5V;; LCSC Part Name: 1个N沟道 耐压:60V 电流:300mA; Supplier Part: C65189; Manufacturer: Nexperia(安世); Supplier Footprint: SOT-23; JLCPCB Part Class: Extended Part; Datasheet: https://item.szlcsc.com/datasheet/2N7002%252C215/66260.html; Supplier: LCSC; Number: 1个N沟道; Drain to Source Voltage: 60V; Current - Continuous Drain(Id): 300mA; RDS(on): 5Ω@10V; Pd - Power Dissipation: 830mW; Gate Threshold Voltage (Vgs(th)): 2.5V; Input Capacitance(Ciss): 50pF; Reverse Transfer Capacitance (Crss@Vds): 3.5pF; Operating Temperature: -65℃~+150℃; Type: N沟道; Output Capacitance(Coss): 6.8pF; Vgs: ±30V
Q3 Q28 = ZXMP10A13FTA: 数量:1个P沟道;漏源电压(Vdss):100V;连续漏极电流(Id):700mA;导通电阻(RDS(on)):1Ω@10V;耗散功率(Pd):625mW;阈值电压(Vgs(th)):2V;; LCSC Part Name: 1个P沟道 耐压:100V 电流:0.7A; Supplier Part: C50185; Manufacturer: DIODES(美台); Supplier Footprint: SOT-23; JLCPCB Part Class: Extended Part; Datasheet: https://item.szlcsc.com/datasheet/ZXMP10A13FTA/51194.html; Supplier: LCSC; Number: 1个P沟道; Drain to Source Voltage: 100V; Current - Continuous Drain(Id): 700mA; RDS(on): 1Ω@10V; Pd - Power Dissipation: 625mW; Gate Threshold Voltage (Vgs(th)): 2V; Gate Charge(Qg): 1.8nC; Input Capacitance(Ciss): 141pF; Reverse Transfer Capacitance (Crss@Vds): 10.8pF; Operating Temperature: -55℃~+150℃; Type: P沟道; Output Capacitance(Coss): 13.1pF; Vgs: ±20V
Q17-Q24 = IRFS4310ZTRLPBF-HXY: 数量:1个N沟道;漏源电压(Vdss):100V;连续漏极电流(Id):260A;导通电阻(RDS(on)):3.4mΩ@10V;耗散功率(Pd):379W;阈值电压(Vgs(th)):3V;; LCSC Part Name: 1个N沟道 耐压:100V 电流:260A; Supplier Part: C20606279; Manufacturer: HXY MOSFET(华轩阳电子); Supplier Footprint: TO-263; JLCPCB Part Class: Extended Part; Datasheet: https://item.szlcsc.com/datasheet/IRFS4310ZTRLPBF-HXY/21947012.html; Supplier: LCSC; Number: 1个N沟道; Drain to Source Voltage: 100V; Current - Continuous Drain(Id): 260A; RDS(on): 3.4mΩ@10V; Pd - Power Dissipation: 379W; Gate Threshold Voltage (Vgs(th)): 3V; Gate Charge(Qg): 150nC@10V; Input Capacitance(Ciss): 9.03nF; Reverse Transfer Capacitance (Crss@Vds): 40pF; Operating Temperature: -55℃~+150℃; Configuration: 独立式; Type: N沟道; Output Capacitance(Coss): 1.505nF
Q5 Q25 = BSS84LT1G: 数量:1个P沟道;漏源电压(Vdss):50V;连续漏极电流(Id):130mA;导通电阻(RDS(on)):10Ω@5V;耗散功率(Pd):225mW;阈值电压(Vgs(th)):2V;; LCSC Part Name: 1个P沟道 耐压:50V 电流:130mA; Supplier Part: C82079; Manufacturer: onsemi(安森美); Supplier Footprint: SOT-23; JLCPCB Part Class: Extended Part; Datasheet: https://item.szlcsc.com/datasheet/BSS84LT1G/83234.html; Supplier: LCSC; Number: 1个P沟道; Drain to Source Voltage: 50V; Current - Continuous Drain(Id): 130mA; RDS(on): 10Ω@5V; Pd - Power Dissipation: 225mW; Gate Threshold Voltage (Vgs(th)): 2V; Gate Charge(Qg): 2.2nC@10V; Input Capacitance(Ciss): 36pF; Reverse Transfer Capacitance (Crss@Vds): 6.5pF; Operating Temperature: -55℃~+150℃; Type: P沟道; Output Capacitance(Coss): 17pF; Vgs: ±20V
Q26 = BSS123N: 数量:1个N沟道;漏源电压(Vdss):100V;连续漏极电流(Id):190mA;导通电阻(RDS(on)):6Ω@10V,0.19A;耗散功率(Pd):500mW;阈值电压(Vgs(th)):1.8V;; Supplier Part: C5157720; Manufacturer: Infineon(英飞凌); Supplier Footprint: SOT-23; JLCPCB Part Class: Extended Part; Datasheet: https://item.szlcsc.com/datasheet/BSS123N/5796689.html; Supplier: LCSC; Number: 1个N沟道; Drain to Source Voltage: 100V; Current - Continuous Drain(Id): 190mA; RDS(on): 6Ω@10V,0.19A; Pd - Power Dissipation: 500mW; Gate Threshold Voltage (Vgs(th)): 1.8V; Input Capacitance(Ciss): 20.9pF@25V; Reverse Transfer Capacitance (Crss@Vds): 3.1pF@25V; Operating Temperature: -55℃~+150℃
R1-R28 R35 R41-R44 R46 R47 R49-R52 R54 R55 R57-R59 R61-R69 R71-R78 R80-R85 R93 R94 = 0805W8F2002T5E: 电阻类型:厚膜电阻;阻值:20kΩ;精度:±1%;功率:125mW;工作电压:150V;温度系数:±100ppm/℃;; LCSC Part Name: 厚膜电阻 20kΩ ±1%; Supplier Part: C4328; Manufacturer: UNI-ROYAL(厚声); Supplier Footprint: 0805; JLCPCB Part Class: Basic Part; Datasheet: https://item.szlcsc.com/datasheet/0805W8F2002T5E/4735.html; Supplier: LCSC; Type: 厚膜电阻; Tolerance: ±1%; Power(Watts): 125mW; Voltage-Supply(Max): 150V; Temperature Coefficient: ±100ppm/℃; Operating Temperature: -55℃~+155℃
R70 = MRF6432(2512)LR070JTS: 电阻类型:-;阻值:-;额定压降:-;功率:-;安装方式:-;; Supplier Part: C76279; Supplier Footprint: 2512; JLCPCB Part Class: Extended Part; Supplier: LCSC
U4 U6 U18 U21 = SMBJ33A: 极性:单向;反向截止电压(Vrwm):33V;钳位电压:53.3V;峰值脉冲电流(Ipp):11.3A;峰值脉冲功率(Ppp):600W@10/1000us;击穿电压(VBR):36.7V;; LCSC Part Name: 单向TVS 33V截止 峰值浪涌电流：11.3A; Supplier Part: C2925492; Manufacturer: Liown(里阳半导体); Supplier Footprint: SMB(DO-214AA); JLCPCB Part Class: Extended Part; Datasheet: https://item.szlcsc.com/datasheet/SMBJ33A/3245204.html; Supplier: LCSC; Polarity: 单向; Reverse Stand-Off Voltage (Vrwm): 33V; Clamping Voltage: 53.3V; Peak Pulse Current (Ipp): 11.3A; Peak Pulse Power Dissipation (Ppp): 600W@10/1000us; Voltage - Breakdown: 36.7V; Reverse Leakage Current (Ir): 1uA; Number of Channels: 单路; Operating Temperature: -55℃~+150℃; level of protection: IEC 61000-4-2; Type: TVS
U8 U9 U25 U27 = SS56: Supplier Part: C9900018665; Supplier Footprint: SMB; JLCPCB Part Class: Extended Part; Supplier: LCSC
U28 = BQ76200PWR: BQ76200 高侧 N 沟道 FET 驱动器; LCSC Part Name: 用于电池保护的充电（CHG）和放电（DSG）高端NMOSFET驱动器，具备快速的FET导通和关断时间; Supplier Part: C216213; Manufacturer: TI(德州仪器); Supplier Footprint: TSSOP-16; JLCPCB Part Class: Extended Part; Datasheet: https://www.ti.com/cn/lit/ds/symlink/bq76200.pdf; Supplier: LCSC; Operating Voltage: 8V~75V; Output Voltage: 9V~14V; Quiescent Current: 40uA; Operating Temperature: -40℃~+85℃; Features: 数字控制；低功耗待机
CN1 = ZX-XH2.54-7PZZ-GW: 插针结构:1x7P;间距:2.5mm;安装方式:直插;参考系列:XH;总PIN数:7P;排数:1;每排PIN数:7;行距:-;额定电流:3A;触头材质:铜合金;触头镀层:锡;工作温度:-25℃~+85℃;; LCSC Part Name: 1x7P 间距:2.5mm 直插 系列:XH; Supplier Part: C42441534; Manufacturer: Megastar(兆星); Supplier Footprint: 插件,P=2.5mm; JLCPCB Part Class: Extended Part; Datasheet: https://item.szlcsc.com/datasheet/ZX-XH2.54-7PZZ-GW/44490573.html; Supplier: LCSC; Pins Structure: 1x7P; Pitch: 2.5mm; Mounting Type: 直插; Reference Series: XH; Number of Pins: 7P; Number of Rows: 1; Number of PINs Per Row: 7; Current Rating: 3A; Contact Material: 铜合金; Contact Plating: 锡; Operating Temperature: -25℃~+85℃; Voltage Rating: 250V; Plastic Material: PA66; Flame Retardant Rating: UL94V-0; Color: 米色; Z-Height of the Board: 7mm; X-Length of Bottom Edge on Board (Spacing Line): 20mm; Y-Width of Bottom Edge on Board: 5.75mm
D1-D3 = MMSZ5232BT1G: 二极管配置:1个独立式;稳压值(标称值):5.6V;稳压值(范围值):5.32V~5.88V;耗散功率(Pd):500mW;; LCSC Part Name: 独立式 耐压:5.6V 电流:5uA@3V; Supplier Part: C72743; Manufacturer: onsemi(安森美); Supplier Footprint: SOD-123; JLCPCB Part Class: Extended Part; Datasheet: https://item.szlcsc.com/datasheet/MMSZ5232BT1G/73855.html; Supplier: LCSC; Diode Configuration: 1个独立式; Zener Voltage(Nom): 5.6V; Reverse Leakage Current (Ir): 5uA@3V; Zener Voltage(Range): 5.32V~5.88V; Pd - Power Dissipation: 500mW; Impedance(Zzt): 11Ω; Impedance(Zzk): 1.6kΩ; Operating Junction Temperature Range: -55℃~+150℃; Tolerance: ±5%
D5 = SM24CANA-02HTG-ES: 极性:双向;反向截止电压(Vrwm):24V;钳位电压:42V;峰值脉冲电流(Ipp):8A@8/20us;峰值脉冲功率(Ppp):340W@8/20us;击穿电压(VBR):28V;; LCSC Part Name: CAN 防护，两路双向ESD静电防护器件，30kV，CJ：15pF；CAN/CANFD/12V、24V电源防护; Supplier Part: C22363686; Manufacturer: ElecSuper(静芯); Supplier Footprint: SOT-23; JLCPCB Part Class: Extended Part; Datasheet: https://item.szlcsc.com/datasheet/SM24CANA-02HTG-ES/23820876.html; Supplier: LCSC; Polarity: 双向; Reverse Stand-Off Voltage (Vrwm): 24V; Clamping Voltage: 42V; Peak Pulse Current (Ipp): 8A@8/20us; Peak Pulse Power Dissipation (Ppp): 340W@8/20us; Voltage - Breakdown: 28V; Reverse Leakage Current (Ir): 100nA; Number of Channels: 双路; Operating Temperature: -40℃~+125℃; level of protection: IEC 61000-4-2; Type: TVS; Junction Capacitance: 18pF
U1 U7 U11 U14 U23 U24 = TP-红色测试点: Supplier Part: C9900007423; Supplier Footprint: TESTPOINT-TH_BD-2P-P2.00; JLCPCB Part Class: Extended Part; Supplier: LCSC
U2 = BQ7693003DBT: 工作电压:6V~36V;最大充电电流:-;电池类型:锂电池；磷酸铁锂电池;电池节数:6~10;; LCSC Part Name: 电池监测系列产品，适用于锂离子和磷酸盐应用; Supplier Part: C67600; Manufacturer: TI(德州仪器); Supplier Footprint: TSSOP-30-4.4mm; JLCPCB Part Class: Extended Part; Datasheet: https://www.ti.com/cn/lit/gpn/bq76920; Supplier: LCSC; The Chip Type: 监测芯片；保护芯片；均衡芯片; Voltage - Supply: 6V~36V; Type of Battery: 锂电池；磷酸铁锂电池; Number of Cells: 6~10; Operating Temperature: -40℃~+85℃; Battery Temperature Detection: 支持; Supply Current (Iq): 40uA; Interface: I2C
U3 = TCAN1042VDQ1: 类型:CAN收发器;数据速率:5Mbps;; Supplier Part: C1544495; Manufacturer: TI(德州仪器); Supplier Footprint: SOIC-8; JLCPCB Part Class: Extended Part; Datasheet: https://www.ti.com/lit/ds/symlink/tcan1042v-q1.pdf; Supplier: LCSC; Type: CAN收发器; Data Rate: 5Mbps; Voltage - Supply: 4.5V~5.5V; Operating Temperature: -55℃~+125℃; Features: 唤醒功能；欠压保护；热关断保护；集成电平移位；ESD保护；TXD占优超时；低功耗模式；总线故障保护
U12 = MAX485ESA_C41365332: 类型:收发器;数据速率:2.5Mbps;; LCSC Part Name: MAX485ESA RS-485/RS422收发器; Supplier Part: C41365332; Manufacturer: ElecSuper(静芯); Supplier Footprint: SOP-8; JLCPCB Part Class: Extended Part; Datasheet: https://item.szlcsc.com/datasheet/MAX485ESA/43113796.html; Supplier: LCSC; Type: 收发器; Number of Drivers: 1; Number of Receivers: 1; Voltage - Supply: 3V~5.5V; Data Rate: 2.5Mbps; Number of Nodes: 32; ESD Protect: ±15kV; Operating Temperature: -40℃~+125℃; Quiescent Supply Current: 1mA; Communication Mode: 半双工; Features: Tx/Rx启用；热关断保护；使能关断；过流保护；低功耗模式
C22-C25 C31-C35 C38-C43 C45-C53 = CAP_0805: Supplier Footprint: 0805
CAN RS485 RS485_MCU = 2.54-1*4P母: 插孔结构:1x4P;间距:2.54mm;行距:-;圆孔/方孔:方孔;安装方式:直插;排数:单排;总孔位数:4P;额定电流:3A;额定电压:-;插孔方向:顶部;塑高:8.5mm;触头材质:青铜;触头镀层:金;工作温度:-40℃~+105℃;; LCSC Part Name: 1x4P 间距:2.54mm 直插; Supplier Part: C2718488; Manufacturer: BOOMELE(博穆精密); Supplier Footprint: 插件,P=2.54mm; JLCPCB Part Class: Extended Part; Datasheet: https://item.szlcsc.com/datasheet/2.54-1*4P%25E6%25AF%258D/2834502.html; Supplier: LCSC; Holes Structure: 1x4P; Pitch: 2.54mm; Circular Hole / Square Hole: 方孔; Mounting Type: 直插; Number of Rows: 单排; Number of Positions: 4P; Current Rating: 3A; Holes Direction: 顶部; Insulation Height: 8.5mm; Contact Material: 青铜; Contact Plating: 金; Operating Temperature: -40℃~+105℃; PIN Length: 3.2mm
ESP32 H2 = 2.54-1*5P母: 插孔结构:1x5P;间距:2.54mm;行距:-;圆孔/方孔:方孔;安装方式:直插;排数:单排;总孔位数:5P;额定电流:3A;插孔方向:顶部;塑高:8.5mm;触头材质:黄铜;触头镀层:金;工作温度:-55℃~+105℃;; LCSC Part Name: 1x5P 间距:2.54mm 直插; Supplier Part: C50950; Manufacturer: BOOMELE(博穆精密); Supplier Footprint: 插件,P=2.54mm; JLCPCB Part Class: Extended Part; Datasheet: https://item.szlcsc.com/datasheet/2.54-1*5P%25E6%25AF%258D/51962.html; Supplier: LCSC; Holes Structure: 1x5P; Pitch: 2.54mm; Circular Hole / Square Hole: 方孔; Mounting Type: 直插; Number of Rows: 单排; Number of Positions: 5P; Current Rating: 3A; Holes Direction: 顶部; Insulation Height: 8.5mm; Contact Material: 黄铜; Contact Plating: 金; Operating Temperature: -55℃~+105℃; PIN Length: 3.2mm
GND INA226 蜂鸣器 = PM254V-11-03-H85: 插孔结构:1x3P;间距:2.54mm;行距:-;圆孔/方孔:方孔;安装方式:直插;排数:单排;总孔位数:3P;额定电流:3A;插孔方向:顶部;塑高:8.5mm;触头材质:黄铜;触头镀层:-;工作温度:-40℃~+105℃;; LCSC Part Name: 1x3P 间距:2.54mm 直插; Supplier Part: C541850; Manufacturer: XFCN(兴飞); Supplier Footprint: 插件,P=2.54mm; JLCPCB Part Class: Extended Part; Datasheet: https://item.szlcsc.com/datasheet/PM254V-11-03-H85/562471.html; Supplier: LCSC; Holes Structure: 1x3P; Pitch: 2.54mm; Circular Hole / Square Hole: 方孔; Mounting Type: 直插; Number of Rows: 单排; Number of Positions: 3P; Current Rating: 3A; Holes Direction: 顶部; Insulation Height: 8.5mm; Contact Material: 黄铜; Operating Temperature: -40℃~+105℃
J1-J6 = HDR-M-2.54_1x1: Supplier Part: C81276; Supplier: LCSC
LED1 LED2 = KT-0805G: 灯头类型:2mmx1.25mm方形灯头;发光颜色:翠绿色;正向压降(Vf):2.6V~3.1V;功率:100mW;正向电流:5mA;波长:513nm~528nm;二极管配置:独立二极管;透镜颜色:无色透明透镜;色温:-;发光强度:430mcd;发光角度:120°;载带方式:-;工作温度:-40℃~+85℃;; LCSC Part Name: 0805 翠绿 高亮; Supplier Part: C2297; Manufacturer: KENTO; Supplier Footprint: 0805; JLCPCB Part Class: Basic Part; Datasheet: https://item.szlcsc.com/datasheet/KT-0805G/2670.html; Supplier: LCSC; Lamp Holder Type: 2mmx1.25mm方形灯头; Illumination Color: 翠绿色; Voltage - Forward(Vf): 2.6V~3.1V; Power(Watts): 100mW; Forward Current: 5mA; Wavelength - Dominant: 513nm~528nm; Peak Wavelength: 525nm; Diode Configuration: 独立二极管; Lens Color: 无色透明透镜; Luminous Intensity: 430mcd; Viewing Angle: 120°; Operating Temperature: -40℃~+85℃
MCU = 2.54-2*7P母: 插孔结构:2x7P;间距:2.54mm;行距:2.54mm;圆孔/方孔:方孔;安装方式:直插;排数:双排;总孔位数:14P;插孔方向:顶部;塑高:-;触头材质:黄铜;触头镀层:-;; LCSC Part Name: 2x7P 间距:2.54mm 直插; Supplier Part: C38844; Manufacturer: BOOMELE(博穆精密); Supplier Footprint: 插件,P=2.54mm; JLCPCB Part Class: Extended Part; Supplier: LCSC; Holes Structure: 2x7P; Pitch: 2.54mm; Row Spacing: 2.54mm; Circular Hole / Square Hole: 方孔; Mounting Type: 直插; Number of Rows: 双排; Number of Positions: 14P; Holes Direction: 顶部; Contact Material: 黄铜
power = 3PIN白色直针插座: Supplier Part: C9900004958; Supplier Footprint: XH2.54MM; JLCPCB Part Class: Extended Part; Supplier: LCSC
R29-R34 R36-R40 R48 R53 R79 = 0805W8F1002T5E_C17414: 电阻类型:厚膜电阻;阻值:10kΩ;精度:±1%;功率:125mW;工作电压:150V;温度系数:±100ppm/℃;; LCSC Part Name: 10kΩ ±1% 125mW 厚膜电阻; Supplier Part: C17414; Manufacturer: UNI-ROYAL(厚声); Manufacturer Part: 0805W8F1002T5E; Supplier Footprint: 0805; JLCPCB Part Class: Basic Part; Datasheet: https://item.szlcsc.com/datasheet/0805W8F1002T5E/18102.html; Supplier: LCSC; Type: 厚膜电阻; Tolerance: ±1%; Power(Watts): 125mW; Voltage-Supply(Max): 150V; Temperature Coefficient: ±100ppm/℃; Operating Temperature: -55℃~+155℃
SW1-SW4 = TS-1101-C-W: 电路结构:单刀单掷;按钮形状:矩形按钮;作用力:2.6N;安装方式:立贴;开关长度:6mm;开关宽度:3.6mm;开关高度:2.5mm;带支架:不带支架;触点电流:50mA;额定电压:12V;带灯:无;工作寿命:5万次;; LCSC Part Name: 6*3.6*2.5mm 立贴 轻触开关; Supplier Part: C318938; Manufacturer: XKB Connection(中国星坤); Supplier Footprint: SMD,6x3.6mm; JLCPCB Part Class: Extended Part; Datasheet: https://item.szlcsc.com/datasheet/TS-1101-C-W/300030.html; Supplier: LCSC; Circuit: 单刀单掷; Actuator Style: 矩形按钮; Operating Force: 2.6N; Mounting Type: 立贴; Length: 6mm; Width: 3.6mm; Switch Height: 2.5mm; with Bracket: 不带支架; Contact Current: 50mA; Voltage Rating: 12V; With Lamp: 无; Life: 5万次; Operating Temperature: -30℃~+85℃
U15 = ESP32-C3-MINI-1-H4_C2935306: 核心芯片:ESP32-C3FH4;频率:2.4GHz;天线形式:板载PCB天线;发射功率:20.5dBm;接收灵敏度:-104dBm;; LCSC Part Name: 不带固件 支持2.4GHz Wi-Fi和蓝牙5的小尺寸模组; Supplier Part: C2935306; Manufacturer: ESPRESSIF(乐鑫); Manufacturer Part: ESP32-C3-MINI-1-H4; Supplier Footprint: SMD,16.6x13.2mm; JLCPCB Part Class: Extended Part; Datasheet: https://item.szlcsc.com/datasheet/ESP32-C3-MINI-1-H4/3284921.html; Supplier: LCSC; Utilized IC / Part: ESP32-C3FH4; Wireless Standard: Bluetooth5.0; Interface Type: I2C；GPIO；UART；SPI；USB；I2S; Antenna Type: 板载PCB天线; Output Power: 20.5dBm; Voltage - Supply: 3V~3.6V; Receive  Current: 82mA; Send  Current: 350mA; Sensitivity: -104dBm; Operating Temperature: -40℃~+105℃
USB1 USB4 = USB4215-03-A: 连接器类型:Type-C;协议标准:USB 2.0;公母:母;端口数量:1;额定电流 - 电源:5A;工作温度:-25℃~+85℃;; LCSC Part Name: Type-C 母; Supplier Part: C37616412; Manufacturer: GCT; Supplier Footprint: SMD; JLCPCB Part Class: Extended Part; Datasheet: https://item.szlcsc.com/datasheet/USB4215-03-A/39339856.html; Supplier: LCSC; Connector Type: Type-C; Protocol Standard: USB 2.0; Gender: 母; Number of Ports: 1; Current Rating-Power: 5A; Voltage Rating: 48V; Detection color: 黑色; Operating Temperature: -25℃~+85℃
CN7 CN8 = XH2.54-2PIN-直针: Supplier Part: C9900011425; Supplier Footprint: XH2.54-2PIN; JLCPCB Part Class: Extended Part; Supplier: LCSC
D26 D28 = 1N4148WS_C2128: 二极管配置:独立式;整流电流:150mA;直流反向耐压(Vr):100V;正向压降(Vf):1.25V@150mA;反向恢复时间(Trr):4ns;; LCSC Part Name: 丝印T4 100V 150mA; Supplier Part: C2128; Manufacturer: CJ(江苏长电/长晶); Supplier Footprint: SOD-323; JLCPCB Part Class: Basic Part; Datasheet: https://item.szlcsc.com/datasheet/1N4148WS/2485.html; Supplier: LCSC; Diode Configuration: 独立式; Pd - Power Dissipation: 200mW; Current - Rectified: 150mA; Voltage - DC Reverse(Vr): 100V; Voltage - Forward(Vf@If): 1.25V@150mA; Non-Repetitive Peak Forward Surge Current: 2A; Reverse Leakage Current (Ir): 1uA@75V; Reverse Recovery Time (trr): 4ns
D27 = BZT52C3V0: 二极管配置:1个独立式;稳压值(标称值):3V;稳压值(范围):2.8V~3.2V;耗散功率(Pd):500mW;; LCSC Part Name: 丝印W2 独立式 耐压:3V 电流:10uA; Supplier Part: C21569; Manufacturer: CJ(江苏长电/长晶); Supplier Footprint: SOD-123; JLCPCB Part Class: Extended Part; Datasheet: https://item.szlcsc.com/datasheet/BZT52C3V0/22290.html; Supplier: LCSC; Diode Configuration: 1个独立式; Zener Voltage(Nom): 3V; Reverse Leakage Current (Ir): 10uA; Zener Voltage(Range): 2.8V~3.2V; Pd - Power Dissipation: 500mW; Impedance(Zzt): 95Ω; Impedance(Zzk): 600Ω; Operating Junction Temperature Range: -55℃~+150℃
DC1 = DC005: 连接器类型:DC电源插座;安装方式:弯插;触点内径:2mm;触点外径:6.3mm;额定电流:500mA;额定电压:12V;工作温度:-30℃~+70℃;; LCSC Part Name: DC电源插座 内径:2mm 外径:6.3mm; Supplier Part: C431533; Manufacturer: SHOU HAN(首韩); Supplier Footprint: 插件; JLCPCB Part Class: Extended Part; Datasheet: https://item.szlcsc.com/datasheet/DC005/427890.html; Supplier: LCSC; Connector Type: DC电源插座; Mounting Type: 弯插; Inside Contact Diameter: 2mm; Outside Contact Diameter: 6.3mm; Current Rating: 500mA; Voltage Rating (Max): 12V; Body Height: 10.9mm; Length: 13.6mm; Width: 9.9mm; Operating Temperature: -30℃~+70℃
R45 R92 = 0805W8F3001T5E: 电阻类型:厚膜电阻;阻值:3kΩ;精度:±1%;功率:125mW;工作电压:150V;温度系数:±100ppm/℃;; LCSC Part Name: 厚膜电阻 3kΩ ±1%; Supplier Part: C17661; Manufacturer: UNI-ROYAL(厚声); Supplier Footprint: 0805; JLCPCB Part Class: Basic Part; Datasheet: https://item.szlcsc.com/datasheet/0805W8F3001T5E/18349.html; Supplier: LCSC; Type: 厚膜电阻; Tolerance: ±1%; Power(Watts): 125mW; Voltage-Supply(Max): 150V; Temperature Coefficient: ±100ppm/℃; Operating Temperature: -55℃~+155℃
R86 R91 = 0805W8F1002T5E_C17414: 电阻类型:厚膜电阻;阻值:10kΩ;精度:±1%;功率:125mW;工作电压:150V;温度系数:±100ppm/℃;; LCSC Part Name: 厚膜电阻 10kΩ ±1%; Supplier Part: C17414; Manufacturer: UNI-ROYAL(厚声); Manufacturer Part: 0805W8F1002T5E; Supplier Footprint: 0805; JLCPCB Part Class: Basic Part; Datasheet: https://item.szlcsc.com/datasheet/0805W8F1002T5E/18102.html; Supplier: LCSC; Type: 厚膜电阻; Tolerance: ±1%; Power(Watts): 125mW; Voltage-Supply(Max): 150V; Temperature Coefficient: ±100ppm/℃; Operating Temperature: -55℃~+155℃
R88 R90 = 0805W8F1003T5E: 电阻类型:厚膜电阻;阻值:100kΩ;精度:±1%;功率:125mW;工作电压:150V;温度系数:±100ppm/℃;; LCSC Part Name: 100kΩ ±1% 125mW 厚膜电阻; Supplier Part: C149504; Manufacturer: UNI-ROYAL(厚声); Supplier Footprint: 0805; JLCPCB Part Class: Basic Part; Datasheet: https://item.szlcsc.com/datasheet/0805W8F1003T5E/160838.html; Supplier: LCSC; Type: 厚膜电阻; Tolerance: ±1%; Power(Watts): 125mW; Voltage-Supply(Max): 150V; Temperature Coefficient: ±100ppm/℃; Operating Temperature: -55℃~+155℃
R89 = 0805W8F1001T5E: 电阻类型:厚膜电阻;阻值:1kΩ;精度:±1%;功率:125mW;最大工作电压:150V;温度系数:±100ppm/℃;; LCSC Part Name: 1kΩ ±1% 125mW 厚膜电阻; Supplier Part: C17513; Manufacturer: UNI-ROYAL(厚声); Supplier Footprint: 0805; JLCPCB Part Class: Basic Part; Datasheet: https://atta.szlcsc.com/upload/public/pdf/source/20200306/C422600_1E6D84923E4A46A82E41ADD87F860B5C.pdf; Supplier: LCSC; Type: 厚膜电阻; Tolerance: ±1%; Power(Watts): 125mW; Overload Voltage (Max): 150V; Temperature Coefficient: ±100ppm/℃; Operating Temperature Range: -55℃~+155℃
R97 = 0805W8F4702T5E: 电阻类型:厚膜电阻;阻值:47kΩ;精度:±1%;功率:125mW;工作电压:150V;温度系数:±100ppm/℃;; LCSC Part Name: 厚膜电阻 47kΩ ±1%; Supplier Part: C17713; Manufacturer: UNI-ROYAL(厚声); Supplier Footprint: 0805; JLCPCB Part Class: Basic Part; Datasheet: https://item.szlcsc.com/datasheet/0805W8F4702T5E/18401.html; Supplier: LCSC; Type: 厚膜电阻; Tolerance: ±1%; Power(Watts): 125mW; Voltage-Supply(Max): 150V; Temperature Coefficient: ±100ppm/℃; Operating Temperature: -55℃~+155℃
U16 = NTC0805-104J4250HAT-ZQH: Supplier Part: C9900089817; Supplier Footprint: R0805; JLCPCB Part Class: Extended Part; Supplier: LCSC
U26 = PC817X2NIP0F_C7437: LCSC Part Name: PC817B   停产; Supplier Part: C7437; Supplier Footprint: SMD-4P; JLCPCB Part Class: Extended Part; Supplier: LCSC
D17 = SS14_C2480: 二极管配置:独立式;正向压降(Vf):550mV@1A;直流反向耐压(Vr):40V;整流电流:1A;; LCSC Part Name: 电压:40V 电流:1A; Supplier Part: C2480; Manufacturer: MDD(辰达半导体); Supplier Footprint: SMA(DO-214AC); JLCPCB Part Class: Basic Part; Datasheet: https://item.szlcsc.com/datasheet/SS14/2857.html; Supplier: LCSC; Diode Configuration: 独立式; Voltage - Forward(Vf@If): 550mV@1A; Voltage - DC Reverse(Vr): 40V; Current - Rectified: 1A; Reverse Leakage Current (Ir): 300uA@40V; Operating Junction Temperature Range: -55℃~+150℃; Non-Repetitive Peak Forward Surge Current: 25A
F2 = PPTC/3A/72V: Supplier Part: C9900021689; Supplier Footprint: TH-2P; JLCPCB Part Class: Extended Part; Supplier: LCSC
L2 = CYA1770-10UH: 电感值:10uH;精度:±20%;额定电流:16.5A;饱和电流(Isat):29A;; LCSC Part Name: 10uH±20%; Supplier Part: C54431899; Manufacturer: SHOU HAN(首韩); Supplier Footprint: SMD,17.5x17.5mm; JLCPCB Part Class: Extended Part; Datasheet: https://item.szlcsc.com/datasheet/CYA1770-10UH/57761873.html; Supplier: LCSC; Tolerance: ±20%; Current Rating: 16.5A; Current - Saturation(Isat): 29A; DC Resistance(DCR): 11.8mΩ
Q7 Q8 Q10-Q12 = BSC059N04LS6: 数量:1个N沟道;漏源电压(Vdss):40V;连续漏极电流(Id):59A;导通电阻(RDS(on)):5.9mΩ@10V;耗散功率(Pd):38W;阈值电压(Vgs(th)):2.3V;; LCSC Part Name: 1个N沟道 耐压:40V 电流:59A; Supplier Part: C534356; Manufacturer: Infineon(英飞凌); Supplier Footprint: TDSON-8FL; JLCPCB Part Class: Extended Part; Datasheet: https://item.szlcsc.com/datasheet/BSC059N04LS6/554740.html; Supplier: LCSC; Number: 1个N沟道; Drain to Source Voltage: 40V; Current - Continuous Drain(Id): 59A; RDS(on): 5.9mΩ@10V; Pd - Power Dissipation: 38W; Gate Threshold Voltage (Vgs(th)): 2.3V; Gate Charge(Qg): 9.4nC@10V; Input Capacitance(Ciss): 830pF; Reverse Transfer Capacitance (Crss@Vds): 21pF; Operating Temperature: -55℃~+175℃
Q13 Q15 = AO3401A: 数量:1个P沟道;漏源电压(Vdss):30V;连续漏极电流(Id):4.2A;导通电阻(RDS(on)):55mΩ@10V;耗散功率(Pd):1.2W;阈值电压(Vgs(th)):1V;; LCSC Part Name: 耐压:30V 电流:4.2A; Supplier Part: C5122001; Manufacturer: TECH PUBLIC(台舟); Supplier Footprint: SOT-23; JLCPCB Part Class: Extended Part; Datasheet: https://item.szlcsc.com/datasheet/AO3401A/5710587.html; Supplier: LCSC; Number: 1个P沟道; Drain to Source Voltage: 30V; Current - Continuous Drain(Id): 4.2A; RDS(on): 55mΩ@10V; Pd - Power Dissipation: 1.2W; Gate Threshold Voltage (Vgs(th)): 1V; Gate Charge(Qg): 8.5nC; Input Capacitance(Ciss): 880pF; Reverse Transfer Capacitance (Crss@Vds): 65pF; Operating Temperature: -55℃~+150℃; Type: P沟道; Output Capacitance(Coss): 105pF; Vgs: ±12V
Q14 Q16 = 2N7002: 数量:1个N沟道;漏源电压(Vdss):60V;连续漏极电流(Id):115mA;导通电阻(RDS(on)):7.5Ω@10V;耗散功率(Pd):200mW;阈值电压(Vgs(th)):2.5V;; LCSC Part Name: 1个N沟道 耐压:60V 电流:115mA; Supplier Part: C727149; Manufacturer: TWGMC(迪嘉); Supplier Footprint: SOT-23; JLCPCB Part Class: Extended Part; Datasheet: https://item.szlcsc.com/datasheet/2N7002/774254.html; Supplier: LCSC; Number: 1个N沟道; Drain to Source Voltage: 60V; Current - Continuous Drain(Id): 115mA; RDS(on): 7.5Ω@10V; Pd - Power Dissipation: 200mW; Gate Threshold Voltage (Vgs(th)): 2.5V; Input Capacitance(Ciss): 50pF; Reverse Transfer Capacitance (Crss@Vds): 5pF; Operating Temperature: -55℃~+150℃; Type: N沟道; Output Capacitance(Coss): 11pF; Vgs: ±20V
R56 R60 = JER2512F3R005: 电阻类型:采样电阻；合金电阻;阻值:5mΩ;精度:±1%;功率:3W;温度系数:±50ppm/℃;安装方式:贴片;; LCSC Part Name: 5mΩ 3W 2512 ±1%; Supplier Part: C46634460; Manufacturer: JIERR(捷而瑞); Supplier Footprint: 2512; JLCPCB Part Class: Extended Part; Datasheet: https://item.szlcsc.com/datasheet/JER2512F3R005/48788262.html; Supplier: LCSC; Type: 采样电阻；合金电阻; Tolerance: ±1%; Power(Watts): 3W; Temperature Coefficient: ±50ppm/℃; Mounting Type: 贴片
U5 = TPD6S300ARUKR: 通道数:4；6;工作电压:2.7V~4.5V;安装方式:表面安装;; LCSC Part Name: USB Type-C端口保护器:VBUS短路过压和IEC ESD保护; Supplier Part: C2876380; Manufacturer: TI(德州仪器); Supplier Footprint: WQFN-20-EP(3x3); JLCPCB Part Class: Extended Part; Datasheet: https://www.ti.com/cn/lit/ds/symlink/tpd6s300a.pdf; Supplier: LCSC; FET Type: 内置FET; Number of Lines: 4；6; Voltage Rating: 2.7V~4.5V; Mounting Type: 表面安装; RDS(on): 392mΩ; Operating temperature: -40℃~+85℃; Length: 3mm; Width: 3mm; Height: 0.8mm; Features: 热保护；过压钳位保护；欠压锁定；短路保护
U17 = INA226AQDGSRQ1: 放大器数:-;共模电压:0V~36V;增益:-;带宽(-3db):-;; LCSC Part Name: 汽车级36V双向零漂移高精度低侧/高侧I2C兼容电流/功率监视器; Supplier Part: C2653835; Manufacturer: TI(德州仪器); Supplier Footprint: VSSOP-10-0.5mm; JLCPCB Part Class: Extended Part; Datasheet: https://www.ti.com/cn/lit/ds/symlink/ina226-q1.pdf; Supplier: LCSC; Vcm - Common Mode Voltage: 0V~36V; Ib - Input Bias Current: 10nA; Vos - Input Offset Voltage: 2.5uV; Operating Temperature: -40℃~+125℃; Differential Voltage: ±40V; Single Supply: 2.7V~5.5V; Quiescent Current: 330uA; Output Current: 10mA; Input Offset Voltage Drift(Vos TC): 0.1uV/℃; Common Mode Rejection Ratio (CMRR): 140dB; Features: 可编程阈值告警；数字输出接口；高边检测；低边检测；功率监控
U19 = IP6559-C: IP6559是一款集成升降压控制器和路径NMOS的控制功能，支持QC2.0 / QC3.0 / QC3+/AFC/FCP/ SCP/ VOOC，以及Type-C USB CPD2.0/PD3.0(PPS)输出快充协议的SOC，为快充适配器和车载充电器提供完整的电源解决方案。 IP6559的高集成度与丰富功能，只需一个电感以及功率MOSFET，就可以实现具有升降压功能的快充方案，可有效减小整体方案的尺寸，降低BOM成本。 IP6559的同步开关升降压系统可提供最大100W功率输出，支持NTC的板级温度检测，; LCSC Part Name: 支持Type-C PD3.0(PPS)等快充协议的升降压SOC; Supplier Part: C5140592; Manufacturer: INJOINIC(英集芯); Supplier Footprint: QFN-48-EP(7x7); JLCPCB Part Class: Extended Part; Datasheet: https://item.szlcsc.com/datasheet/IP6559-C/5754307.html; Supplier: LCSC; Type: 供电控制器; Protocol: QC 3+；QC 2.0；FCP；AFC；QC 3.0；VOOC；PD 3.0；SCP；PD 2.0; Number of Channels: 1C; Output Power: 100W; Output Voltage: 5V；20V；15V；12V；9V; Voltage - Supply: 3.6V~31V; Features: 热保护；过压保护；短路保护；自动协议检测；软启动；带使能；欠压保护；过流保护
U20 U22 = 100uF贴片电解: Supplier Part: C9900002196; Supplier Footprint: 100uF; JLCPCB Part Class: Extended Part; Supplier: LCSC
D4 = SS110: 二极管配置:1个独立式;正向压降(Vf):850mV@1A;直流反向耐压(Vr):100V;整流电流:1A;; LCSC Part Name: 电压:100V 电流:1A; Supplier Part: C488407; Manufacturer: Slkor(萨科微); Supplier Footprint: SMA(DO-214AC); JLCPCB Part Class: Extended Part; Datasheet: https://item.szlcsc.com/datasheet/SS110/498142.html; Supplier: LCSC; Diode Configuration: 1个独立式; Voltage - Forward(Vf@If): 850mV@1A; Voltage - DC Reverse(Vr): 100V; Current - Rectified: 1A; Reverse Leakage Current (Ir): 500uA@100V; Operating Junction Temperature Range: -65℃~+125℃; Non-Repetitive Peak Forward Surge Current: 40A
L1 = APS0650M470A: 电感值:47uH;精度:±20%;额定电流:2.02A;饱和电流(Isat):2.62A;; LCSC Part Name: 47uH ±20% 2.62A; Supplier Part: C47327224; Manufacturer: Coilank(驰兴电感); Supplier Footprint: SMD,7.7x6.6mm; JLCPCB Part Class: Extended Part; Datasheet: https://item.szlcsc.com/datasheet/APS0650M470A/49538152.html; Supplier: LCSC; Tolerance: ±20%; Current Rating: 2.02A; Current - Saturation(Isat): 2.62A; DC Resistance(DCR): 227mΩ
U10 = MP9486AGN-Z: 功能类型:降压型;工作电压:4.5V~100V;输出电压:-;输出电流:1A;输出类型:可调;; LCSC Part Name: 降压型 1A 4.5V~100V; Supplier Part: C404013; Manufacturer: MPS(芯源); Supplier Footprint: SOIC-8-EP; JLCPCB Part Class: Extended Part; Datasheet: https://item.szlcsc.com/datasheet/MP9486AGN-Z/391004.html; Supplier: LCSC; Function: 降压型; Voltage - Supply: 4.5V~100V; Output Current: 1A; Frequency - Switching: 1MHz; Operating Temperature: -40℃~+125℃@(TJ); Synchronous Rectifier: 否; Number of Outputs: 1; Topology: 降压式; Quiescent Current: 170uA; Switch tube (built-in/external): 内置; Output Type: 可调; Features: 过流保护；打嗝限流
U13 = RT9080-33GJ5: 输出极性:正极;工作电压:5.5V;输出电压:3.3V;输出电流:600mA;电源纹波抑制比(PSRR):75dB@(1kHz);输出类型:固定;; LCSC Part Name: 3.3V 600mA 5.5V; Supplier Part: C841192; Manufacturer: RICHTEK(立锜); Supplier Footprint: TSOT-23-5; JLCPCB Part Class: Extended Part; Datasheet: https://item.szlcsc.com/datasheet/RT9080-33GJ5/897967.html; Supplier: LCSC; Output Configuration: 正极; Voltage - Supply: 5.5V; Output Voltage: 3.3V; Output Current: 600mA; Power Supply Rejection Ratio (PSRR): 75dB@(1kHz); Voltage Dropout: 360mV@(600mA); standby current: 2uA; Noise: 42uVrms; Features: 短路保护；过流保护；使能控制；热关断; Operating Temperature: -40℃~+125℃@(Tj); Output Type: 固定; Number of Outputs: 1

## Nets
3.3V: C24.2 C25.2 C31.2 C33.2 C34.2 C35.2 INA226.2 MCU.1 power.2 R19.2 R20.2 R28.1 R29.2 R32.2 R33.2 R34.2 R38.2 R39.2 R40.2 R44.2 R48.2 R49.2 R53.2 R55.2 R79.2 U3.5(VIO) U5.10(VPWR) U13.5(VOUT) U15.3(3V3) U17.6(VS+) U28.5(CP-EN) 蜂鸣器.1
5V_RS485: C13.2 Q5.3(D) U12.8(VCC)
+5V: C22.2 C23.2 C26.1 C28.1 C29.1 CAN.1 L1.2 power.1 Q5.2(S) R26.2 R80.1 RS485.1 U3.3(VCC) U13.1(VIN) U13.3(EN)
GND: C1.1 C12.1 C13.1 C15.1 C16.2 C17.2 C19.2 C20.2 C22.1 C23.1 C24.1 C25.1 C26.2 C27.2 C28.2 C29.2 C30.2 C31.1 C32.1 C33.1 C34.1 C35.1 C39.1 C40.1 C41.2 C42.2 C43.1 C46.1 C47.1 C51.2 C52.1 C53.1 C54.2 C56.2 C64.1 C65.1 CAN.4 CN1.7 CN7.1 D4.2(A) D5.3 D22.2 D26.2(A) D27.2(A) ESP32.1 GND.1 GND.2 GND.3 INA226.3 J1.1 J2.1 J3.1 J4.1 J6.1 LED1.2(K) LED2.2(K) MCU.2 power.3 Q2.2(S) Q4.2(S) Q7.1(S) Q7.2(S) Q7.3(S) Q10.1(S) Q10.2(S) Q10.3(S) Q14.2(S) Q16.2(S) Q29.2(S) Q30.2(S) R1.1 R13.2 R16.2 R24.2 R27.1 R36.1 R37.2 R41.1 R42.1 R46.1 R51.1 R70.1 R83.2 R90.1 R94.2 RS485.4 SW1.1 SW3.1 SW4.1 U2.3(VSS) U3.2(GND) U4.2(A) U5.6(RPD_G2) U5.7(RPD_G1) U5.8(GND) U5.13(GND) U5.16(N.C) U5.17(N.C) U5.18(GND) U5.21(PAD) U6.2(A) U9.2(A) U10.8(GND) U10.9(EP) U12.5(GND) U13.2(GND) U15.1(GND) U15.2(GND) U15.11(GND) U15.14(GND) U15.36(GND) U15.37(GND) U15.38(GND) U15.39(GND) U15.40(GND) U15.41(GND) U15.42(GND) U15.43(GND) U15.44(GND) U15.45(GND) U15.46(GND) U15.47(GND) U15.48(GND) U15.49(GND) U15.50(GND) U15.51(GND) U15.52(GND) U15.53(GND) U16.2 U17.1(A1) U17.2(A0) U17.7(GND) U18.2(A) U19.5(GPIO18/EN) U19.11(AGND) U19.30(AGND) U19.49(EP) U20.2 U21.2(A) U22.2 U26.2(CAT) U28.8(PCHG-EN) U28.9(VSS) USB1.13(EH) USB1.14(EH) USB1.15(EH) USB1.16(EH) USB1.A1B12(GND) USB1.B1A12(GND) USB4.13(EH) USB4.14(EH) USB4.15(EH) USB4.16(EH) USB4.A1B12(GND) USB4.B1A12(GND) 蜂鸣器.3
AFE_CHG: U2.2(CHG) U28.4(CHG-EN)
AFE_DSG: U2.1(DSG) U28.6(DSG-EN)
ALERT: MCU.5 R16.1 U2.30(ALERT) U11.1
BAT1: C5.1 C6.2 CN1.4 Q28.2(S) R6.1 R7.1 R17.1 R88.2 R97.1
BAT+: C10.2 C20.1 C27.1 C30.1 C54.1 C55.1 C57.1 CN1.1 D7.2(A) J5.1 Q17.3(S) Q18.3(S) Q19.3(S) Q20.3(S) R11.1 R14.1 R18.2 R65.2 R84.2 U4.1(C) U10.3(VIN)
BOOT_LIMIT: D27.1(K) D28.2(A) R92.1
BOOT_MANUAL: R45.1 SW2.2
BQV1: C16.1 R47.2 R89.1 U2.8(REGOUT)
BST1: C49.2 U6.1(C) U19.17(BST1)
BST2: C48.2 U18.1(C) U19.22(BST2)
BUZZER_EN: 蜂鸣器.2
CAN_RX: MCU.10 U3.4(RXD)
CAN_STB: MCU.11 U3.8(STB)
CAN_TX: MCU.9 U3.1(TXD)
CANH: CAN.3 D5.1 R52.2 U3.7(CANH)
CANL: CAN.2 D5.2 R52.1 U3.6(CANL)
CC1: Q15.3(D) U5.12(CC1) U19.41(CC1)
CC2: Q13.3(D) U5.11(CC2) U19.38(CC2)
CELL1: C1.2 C2.1 CN1.6 R2.1
CELL2: C2.2 C3.1 C3.2 C4.1 C4.2 C6.1 CN1.5 R3.1 R4.1 R5.1
CELL4: C5.2 C7.1 CN1.3 R8.1
CELL5: C7.2 C8.1 C8.2 C9.1 C9.2 C10.1 CN1.2 R9.1 R10.1 R15.1
CSN1: C41.1 C42.1 C50.1 D17.2(A) Q12.5(D) Q12.6(D) Q12.7(D) Q12.8(D) Q12.9(D) R60.1 U17.9(VIN-) U19.10(VOUTI) U19.12(VIO) U19.13(CSN1)
CSN2: C45.1 R57.1 U19.25(CSN2)
CSP1: C50.2 R61.1 U19.14(CSP1)
CSP2: C45.2 F2.2 R56.2 U19.26(CSP2) U19.27(VIN) U20.1 U22.1
DBG_USB_VBUS: USB1.A4B9(VBUS) USB1.B4A9(VBUS)
DC_IN: DC1.1 R86.1 R91.1 U25.2(A)
DMC: U5.15(SUB1) U19.40(DMC)
DPC: U5.14(SBU2) U19.39(DPC)
DSG_G: D8.1(K) D19.1(K) Q25.2(S) R66.1 R67.1 R68.1 R69.1 R71.2 R73.1
ESP_EVENT_N: ESP32.3 R29.1 U15.6(IO3)
ESP_RST_N: C53.2 ESP32.2 R53.1 SW4.2 U15.8(EN)
ESP_RX: ESP32.5 U15.30(RXD0)
ESP_TX: ESP32.4 U15.31(TXD0)
GPIO21: Q16.1(G) R42.2 U19.46(GPIO21)
GPIO22: Q14.1(G) R41.2 U19.47(GPIO22)
HG1: Q11.4(G) U19.16(HG1)
HG2: Q8.4(G) U19.23(HG2)
HS_CHG_DRV: R64.2 U28.16(CHG)
HS_DSG_DRV: R76.2 U28.12(DSG)
IO2: R32.1 U15.5(IO2)
IO4: H2.4 R39.1 U15.18(IO4)
IO5: H2.3 R38.1 U15.19(IO5)
IO6: H2.2 R48.1 U15.20(IO6)
IO7: H2.1 R40.1 U15.21(IO7)
IO10: H2.5 R79.1 U15.16(IO10)
J_RS485_A: RS485.3 U12.6(A)
J_RS485_B: RS485.2 U12.7(B)
J_RS485_DI: RS485_MCU.1 U12.4(DI)
J_RS485_RO: RS485_MCU.3 U12.1(RO)
KEY_IN: C39.2 MCU.13 R49.1 SW1.2
LED_GREEN: R31.2 U15.12(IO0)
LED_RED: R30.2 U15.13(IO1)
LG1: Q10.4(G) U19.19(LG1)
LG2: Q7.4(G) U19.20(LG2)
LX1: C49.1 L2.1 Q10.5(D) Q10.6(D) Q10.7(D) Q10.8(D) Q10.9(D) Q11.1(S) Q11.2(S) Q11.3(S) R59.2 U19.18(LX1)
LX2: C48.1 L2.2 Q7.5(D) Q7.6(D) Q7.7(D) Q7.8(D) Q7.9(D) Q8.1(S) Q8.2(S) Q8.3(S) R58.2 U19.21(LX2)
MCU_ADC_NTC: MCU.8 R44.1 U16.1
MCU_WAKE_BQ: D2.2(A) MCU.6
MID+: D6.1(K) Q3.2(S) Q17.2(D) Q18.2(D) Q19.2(D) Q20.2(D) Q21.2(D) Q22.2(D) Q23.2(D) Q24.2(D) R21.1
MP9486_EN: R46.2 R47.1 U10.6(DIM) U10.7(EN)
P+: C58.2 C59.1 D8.2(A) D14.2(A) F2.1 Q21.3(S) Q22.3(S) Q23.3(S) Q24.3(S) Q26.2(S) R25.2 R71.1 R72.1 R74.1 R85.2 U21.1(C) U25.1(K) U27.1(K)
P-: C60.2 DC1.2 DC1.3 R70.2 R75.1 R82.2 U27.2(A)
PACKDIV_adc: C12.2 MCU.7 R12.2 R13.1
PCIN: Q8.5(D) Q8.6(D) Q8.7(D) Q8.8(D) Q8.9(D) R56.1 R57.2 U19.24(PCIN)
PCON: Q11.5(D) Q11.6(D) Q11.7(D) Q11.8(D) Q11.9(D) R60.2 R61.2 U17.10(VIN+) U19.15(PCON)
PMON-EN: MCU.12 U28.7(PMON-EN)
PRECHARGE_REQ: MCU.14 R23.1
RS485_DIR: RS485_MCU.2 U12.2(RE#) U12.3(DE)
RS485_PWR_EN: R93.1 RS485_MCU.4
SCL: MCU.4 R20.1 U2.5(SCL) U7.1 U17.5(SCL)
SDA: MCU.3 R19.1 U1.1 U2.4(SDA) U17.4(SDA)
SRN: C61.2 C62.2 R82.1 U2.29(SRN)
SRP: C61.1 C62.1 R83.1 U2.28(SRP)
TS1: C40.2 CN7.2 D2.1(C) D28.1(K) SW2.1 U2.6(TS1) U14.1
TS2: C38.2 CN8.2 U2.13(TS2) U23.1
USB_ALERT: INA226.1 R55.1 U17.3(Alert)
USB_CC1: U5.4(C_CC1) USB4.A5(CC1)
USB_CC2: U5.5(C_CC2) USB4.B5(CC2)
USB_D+: U15.27(IO19) USB1.A6(Dp1) USB1.B6(Dp2)
USB_D-: U15.26(IO18) USB1.A7(Dn1) USB1.B7(Dn2)
USB_DMC: U5.1(C_SUB1) USB4.A7(Dn1) USB4.B7(Dn2)
USB_DPC: U5.2(C_SUB2) USB4.A6(Dp1) USB4.B6(Dp2)
USB_ESD_FLT: R28.2 U5.9(FLT#)
USB_VBUS: C43.2 Q12.1(S) Q12.2(S) Q12.3(S) U17.8(VBUS) U19.48(VOUT2) USB4.A4B9(VBUS) USB4.B4A9(VBUS)
VC0: R1.2 U2.27(VC0)
VC1: R2.2 R45.2 U2.26(VC1)
VC2: R3.2 U2.25(VC2)
VC3: R4.2 U2.24(VC3)
VC4: R5.2 U2.23(VC4)
VC5: D1.2(A) R6.2 U2.22(VC5) U24.1
VC5B: R7.2 U2.21(VC5B)
VC5x: C11.2 C18.2 C38.1 CN8.1 D1.1(C) U2.10(VC5x) U8.2(A)
VC6: R8.2 U2.20(VC6)
VC7: R9.2 U2.19(VC7)
VC8: R10.2 U2.18(VC8)
VC9: R15.2 U2.17(VC9)
VC10: D3.2(A) R11.2 U2.16(VC10)
VOUT2G: Q12.4(G) U19.1(VOUT2G)
WAKE_ALLOW: Q29.1(G) Q30.3(D) R88.1
WAKE_G: Q28.1(G) R97.2 U26.4(COL)
WAKE_LED_A: D26.1(K) R86.2 R91.2 U26.1(AN)
WAKE_OFF_G: Q30.1(G) R89.2 R90.2
WAKE_OPTO_E: Q29.3(D) U26.3(EM)
WAKE_RAW: Q28.3(D) R92.2
$1N76: C17.1 U2.7(CAP1)
$1N110: C11.1 U2.14(CAP2)
$1N114: C18.1 D3.1(C) R14.2 U2.15(BAT) U8.1(K)
$1N127: C19.1 Q1.1(G) R17.2 U9.1(K)
$1N129: Q1.3(D) R18.1
$1N133: C15.2 Q1.2(S) U2.9(REGSRC)
$1N295: Q5.1(G) R80.2 R81.1
$1N297: Q4.3(D) R81.2
$1N298: Q4.1(G) R93.2 R94.1
$2N14: C21.2 U10.4(BST)
$2N15: C21.1 D4.1(C) L1.1 U10.5(SW)
$2N19: R26.1 R27.2 U10.1(FB)
$4N92: C46.2 R58.1
$4N94: C47.2 R59.1
$4N113: R51.2 U19.37(GPIO0/NTC)
$4N128: Q13.1(G) Q14.3(D) R50.1
$4N133: Q15.1(G) Q16.3(D) R43.1
$4N135: D17.1(K) Q13.2(S) Q15.2(S) R43.2 R50.2
$4N138: C51.1 U19.29(VCC5V)
$4N140: C52.2 U19.32(VCCIO)
$4N178: C32.2 U5.3(VBIAS)
$5N86: LED1.1(A) R30.1
$5N88: LED2.1(A) R31.1
$5N94: R33.1 U15.22(IO8)
$5N96: R34.1 SW3.2 U15.23(IO9)
$5N117: R36.2 USB1.B5(CC2)
$5N118: R37.1 USB1.A5(CC1)
$6N1: C55.2 C56.1
$6N4: Q18.1(G) R35.1
$6N5: Q19.1(G) R54.1
$6N6: Q20.1(G) R62.1
$6N7: Q17.1(G) R63.1
$6N10: D7.1(K) R35.2 R54.2 R62.2 R63.2 R64.1 R65.1
$6N15: Q24.1(G) R66.2
$6N16: Q23.1(G) R67.2
$6N17: Q22.1(G) R68.2
$6N18: Q21.1(G) R69.2
$6N21: C57.2 C58.1
$6N23: Q25.3(D) R72.2
$6N24: Q26.3(D) R73.2
$6N25: D14.1(K) D21.1 Q26.1(G) R74.2
$6N26: D18.2 D19.2(A) Q25.1(G) R78.1
$6N27: D21.2 R75.2
$6N29: C59.2 C60.1
$6N30: D18.1 R77.1 R78.2
$6N31: D22.1 R76.1 R77.2
$6N43: C63.1 U28.1(VDDCP)
$6N44: C63.2 C64.2 R84.1 U28.2(BAT)
$6N51: C65.2 R85.1 U28.11(PACK)
$6N65: R12.1 U28.10(PACKDIV)
$6N73: D6.2(A) Q3.1(G) R21.2 R22.1
$6N74: Q2.3(D) R22.2
$6N76: Q2.1(G) R23.2 R24.1
$6N77: Q3.3(D) R25.1

Not connected (* = marked no-connect by the designer): U2 11(NC)* 12(NC)*; U5 19(D2)* 20(D1)*; U10 2(NC)*; U13 4(NC)*; U15 4(NC)* 7(NC)* 9(NC)* 10(NC)* 15(NC)* 17(NC)* 24(NC)* 25(NC)* 28(NC)* 29(NC)* 32(NC)* 33(NC)* 34(NC)* 35(NC)*; U19 2(NC)* 3(NC)* 4(GPIO17/VOOCID)* 6(NC)* 7(NC)* 8(NC)* 9(NC)* 28(NC)* 31(NC)* 33(GPIO4)* 34(GPIO3)* 35(GPIO2)* 36(GPIO1)* 42(DPA)* 43(DMA)* 44(VOUT1)* 45(VOUT1G)*; U28 3(NC)* 13(NC)* 14(PCHG)* 15(NC)*; USB1 A8(SBU1)* B8(SBU2)*; USB4 A8(SBU1)* B8(SBU2)*

## Notes on the sheets
sheet 1
- VIO 接 MCU 的 I/O 电压；
- 当你的 CAN 总线形成真正的总线结构，并且你的节点位于总线末端时，需要DNP~120R。
sheet 3
- 25.2V DC 自动唤醒（REGOUT反馈关闭）
- BAT1：三节电芯中点；待样机验证
sheet 4
- A1、A0 都接 INA226 本地 GND，7位地址设为 0x40
sheet 5
- 低电平工作
- ESP_RST_N：STM32的GPIO，配置为开漏输出：拉低复位，释放后运行。
- 要确认 STM32 复位期间该 GPIO 是高阻。有些 MCU 复位时引脚是低电平，那就会把 ESP32 一直按在复位状态里，永远起不来
